# EasyEDA Pro project 眼球小板_立创文件.epro, schematic Schematic1

## Sheets
1 Power: Assembly Variant: Basic; Board Name: Board1; Create Date: 2026-07-28; Page Name: P1; Project Name: AI小板; Schematic Name: Schematic1; Update Date: 2026-07-28; Company: 嘉立创EDA; Page Size: A4; Version: V1.0
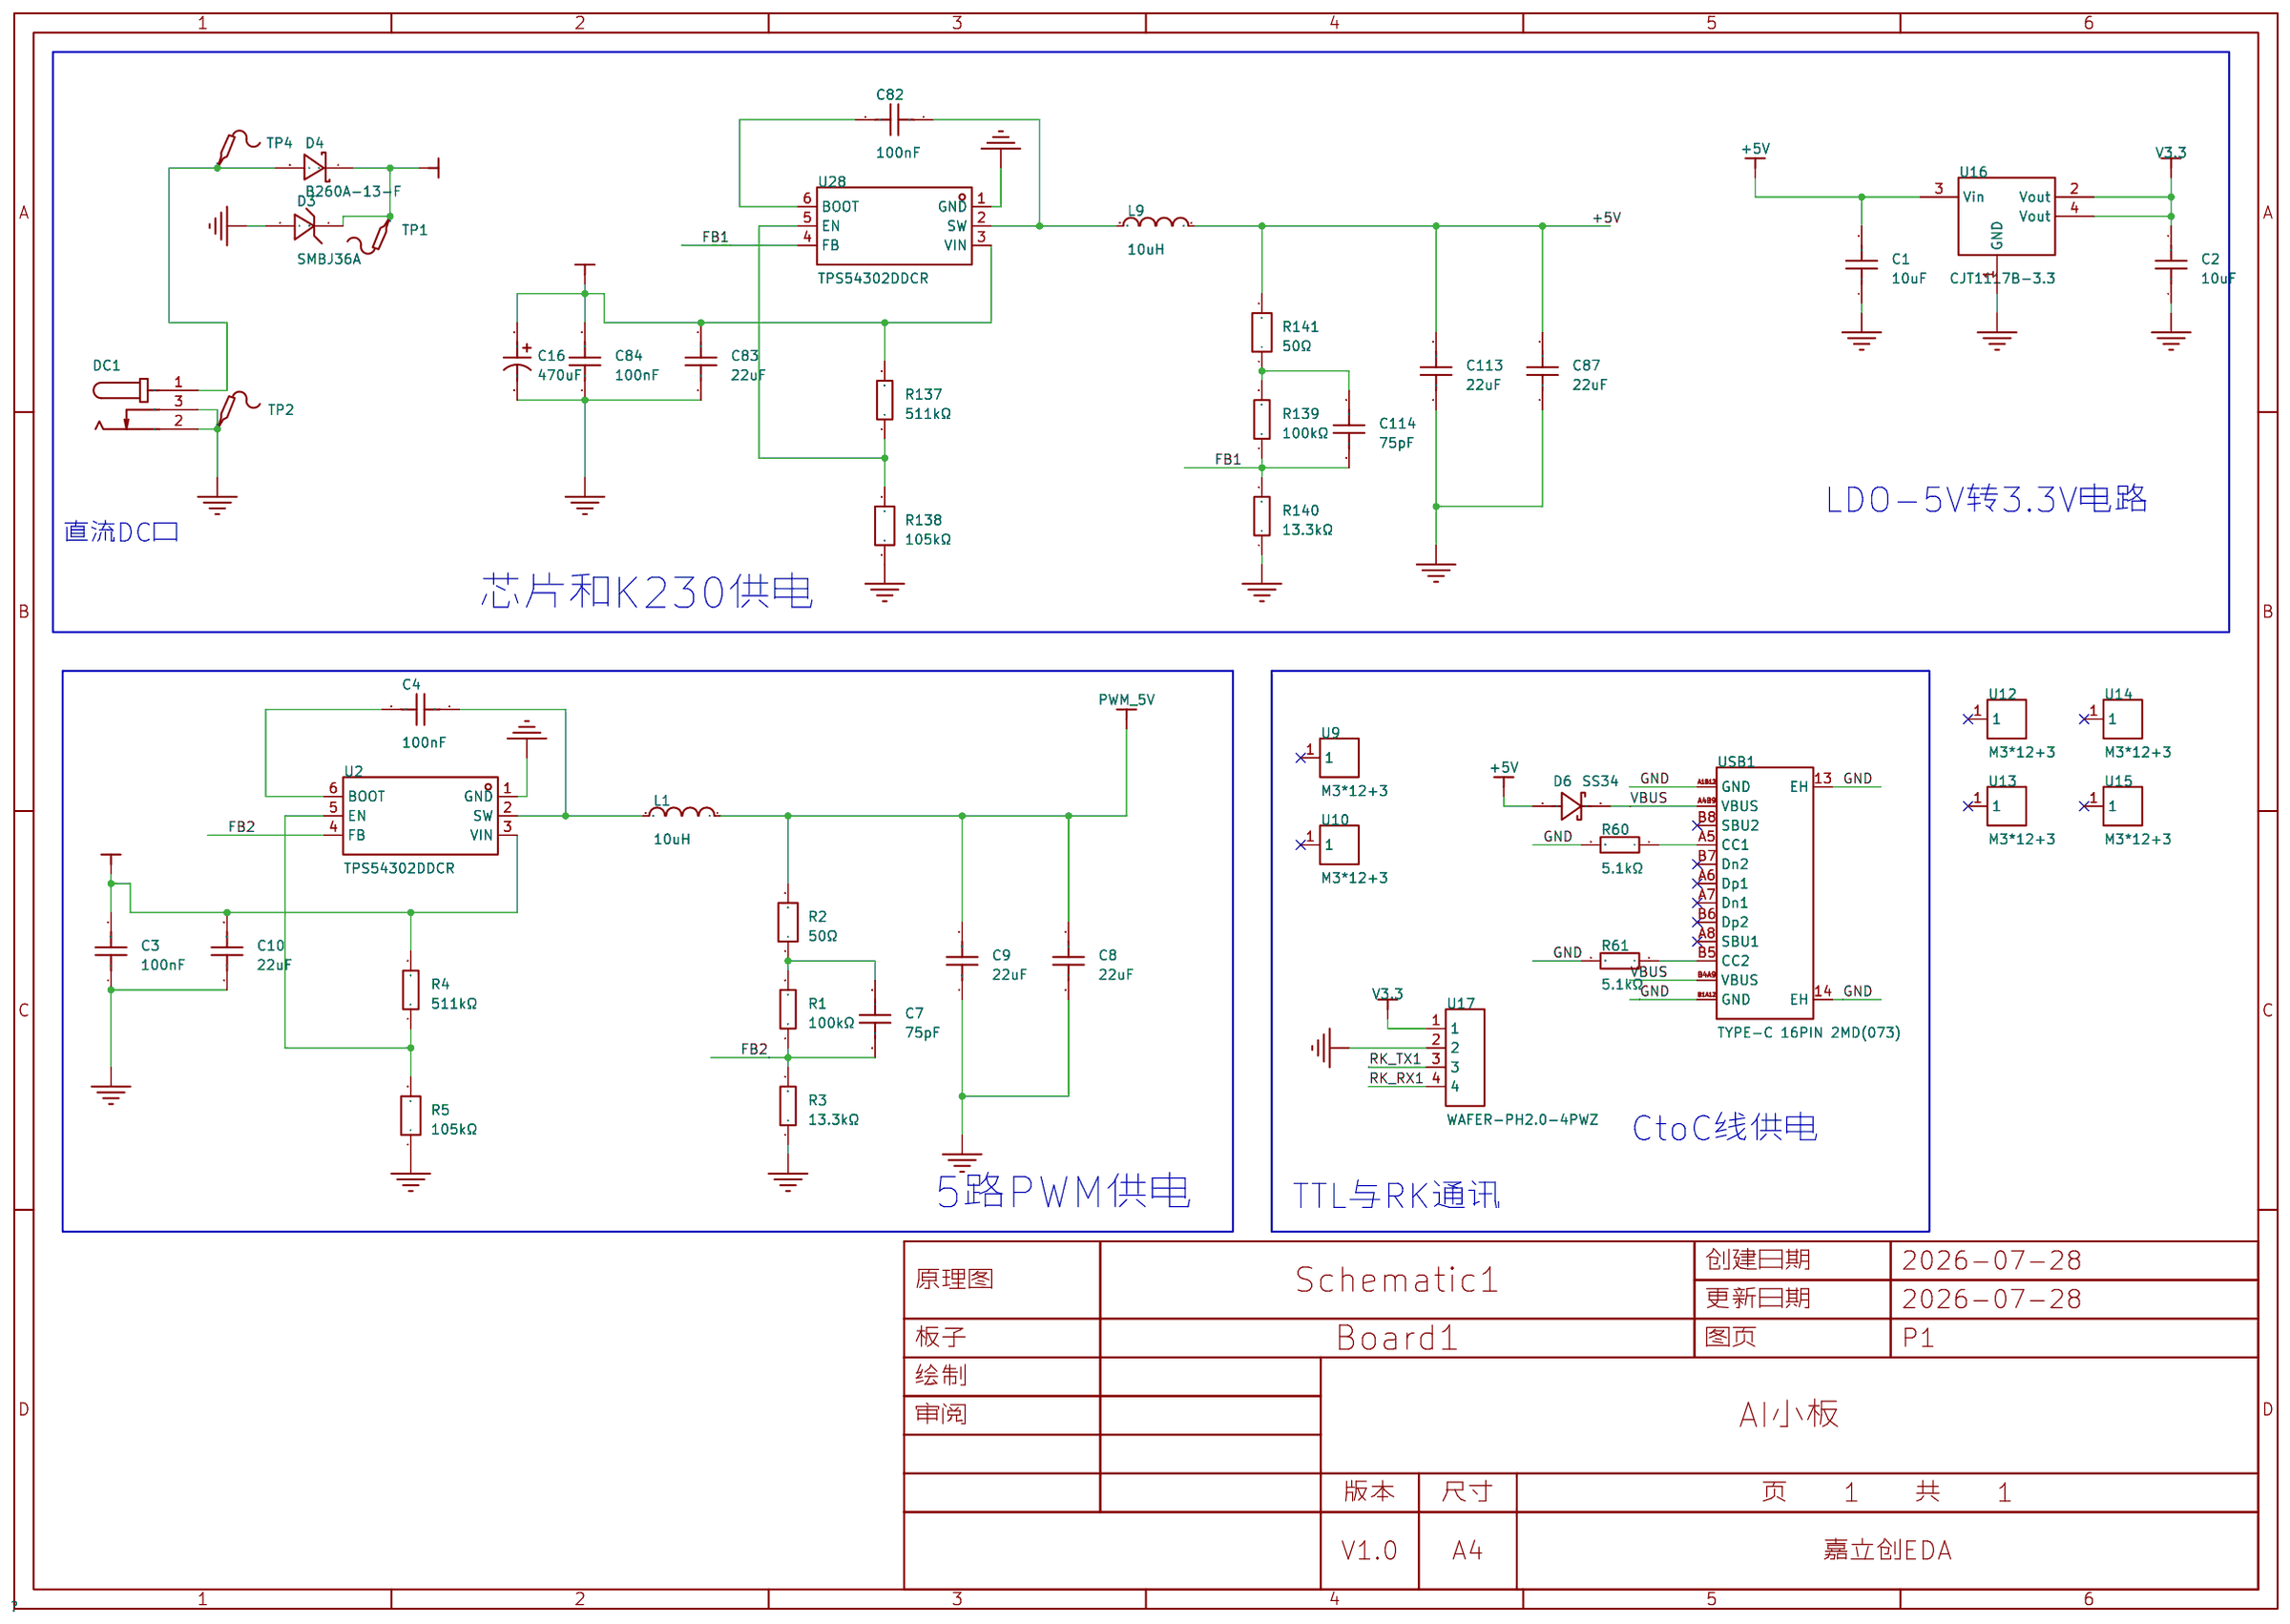
[diagram p0: Power]
2 five_PWM: Create Date: 2026-07-16; Update Date: 2026-07-16
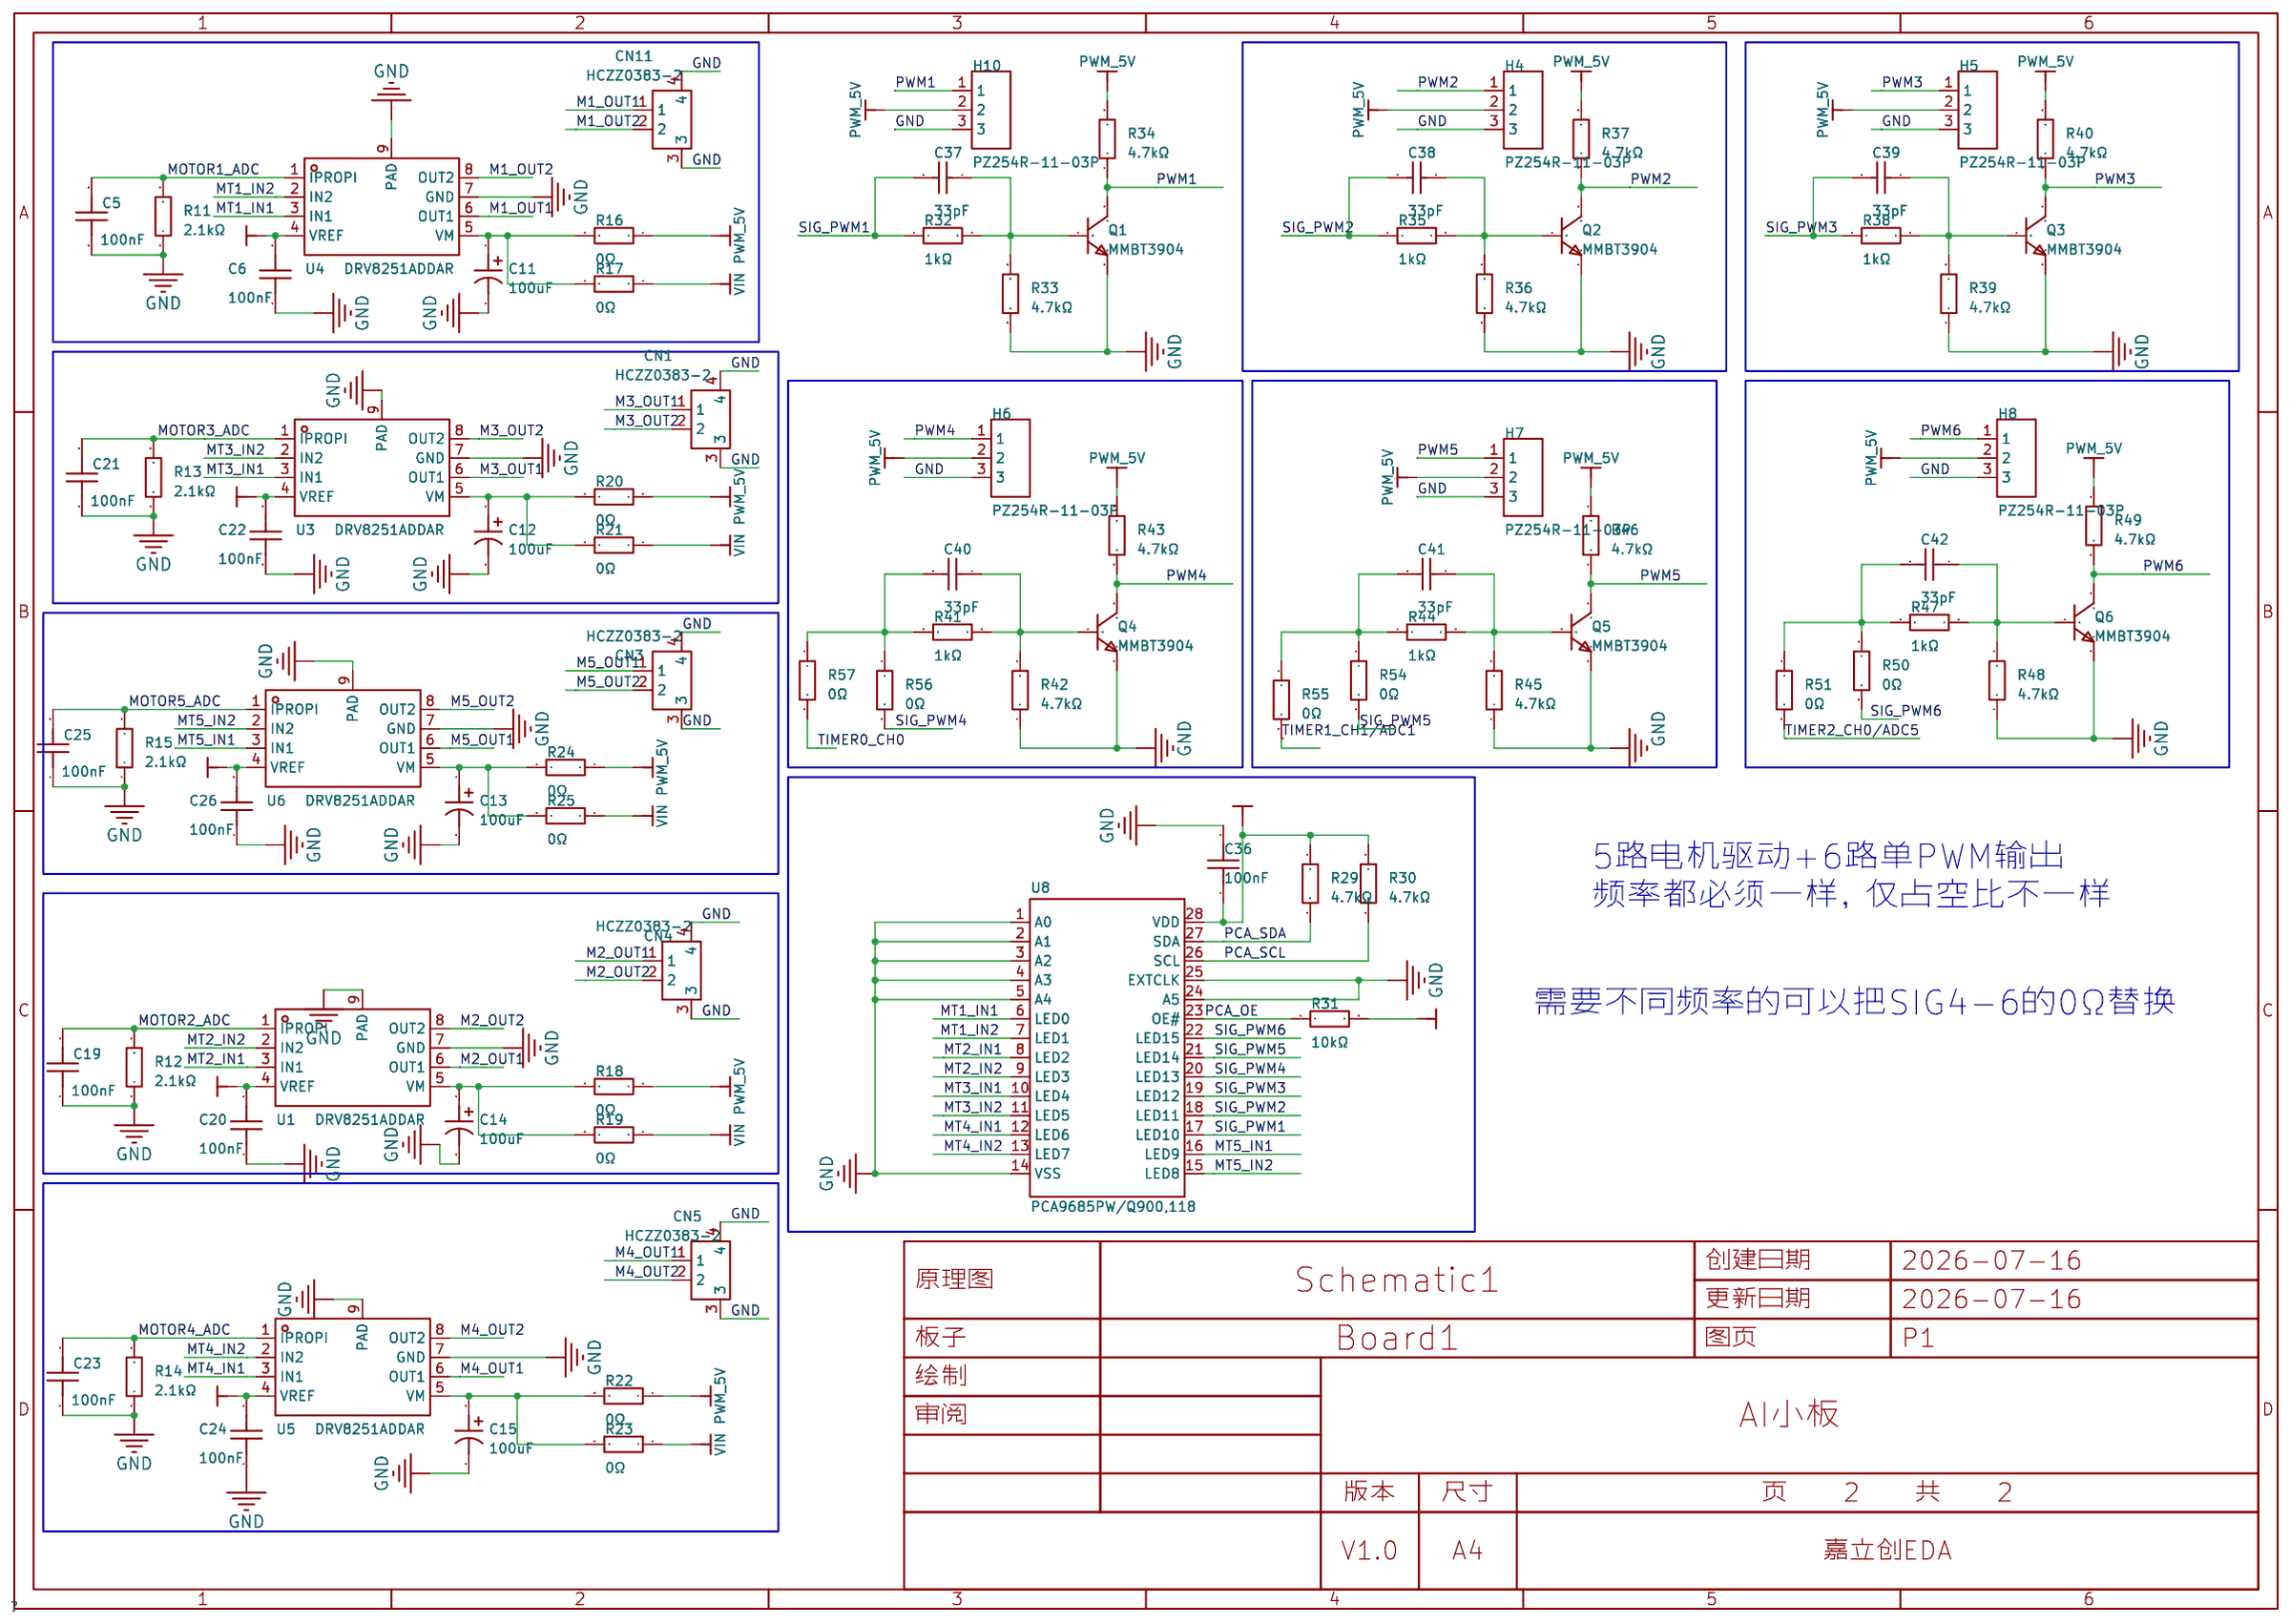
[diagram p1: five_PWM]
3 MCU: Page Name: P2
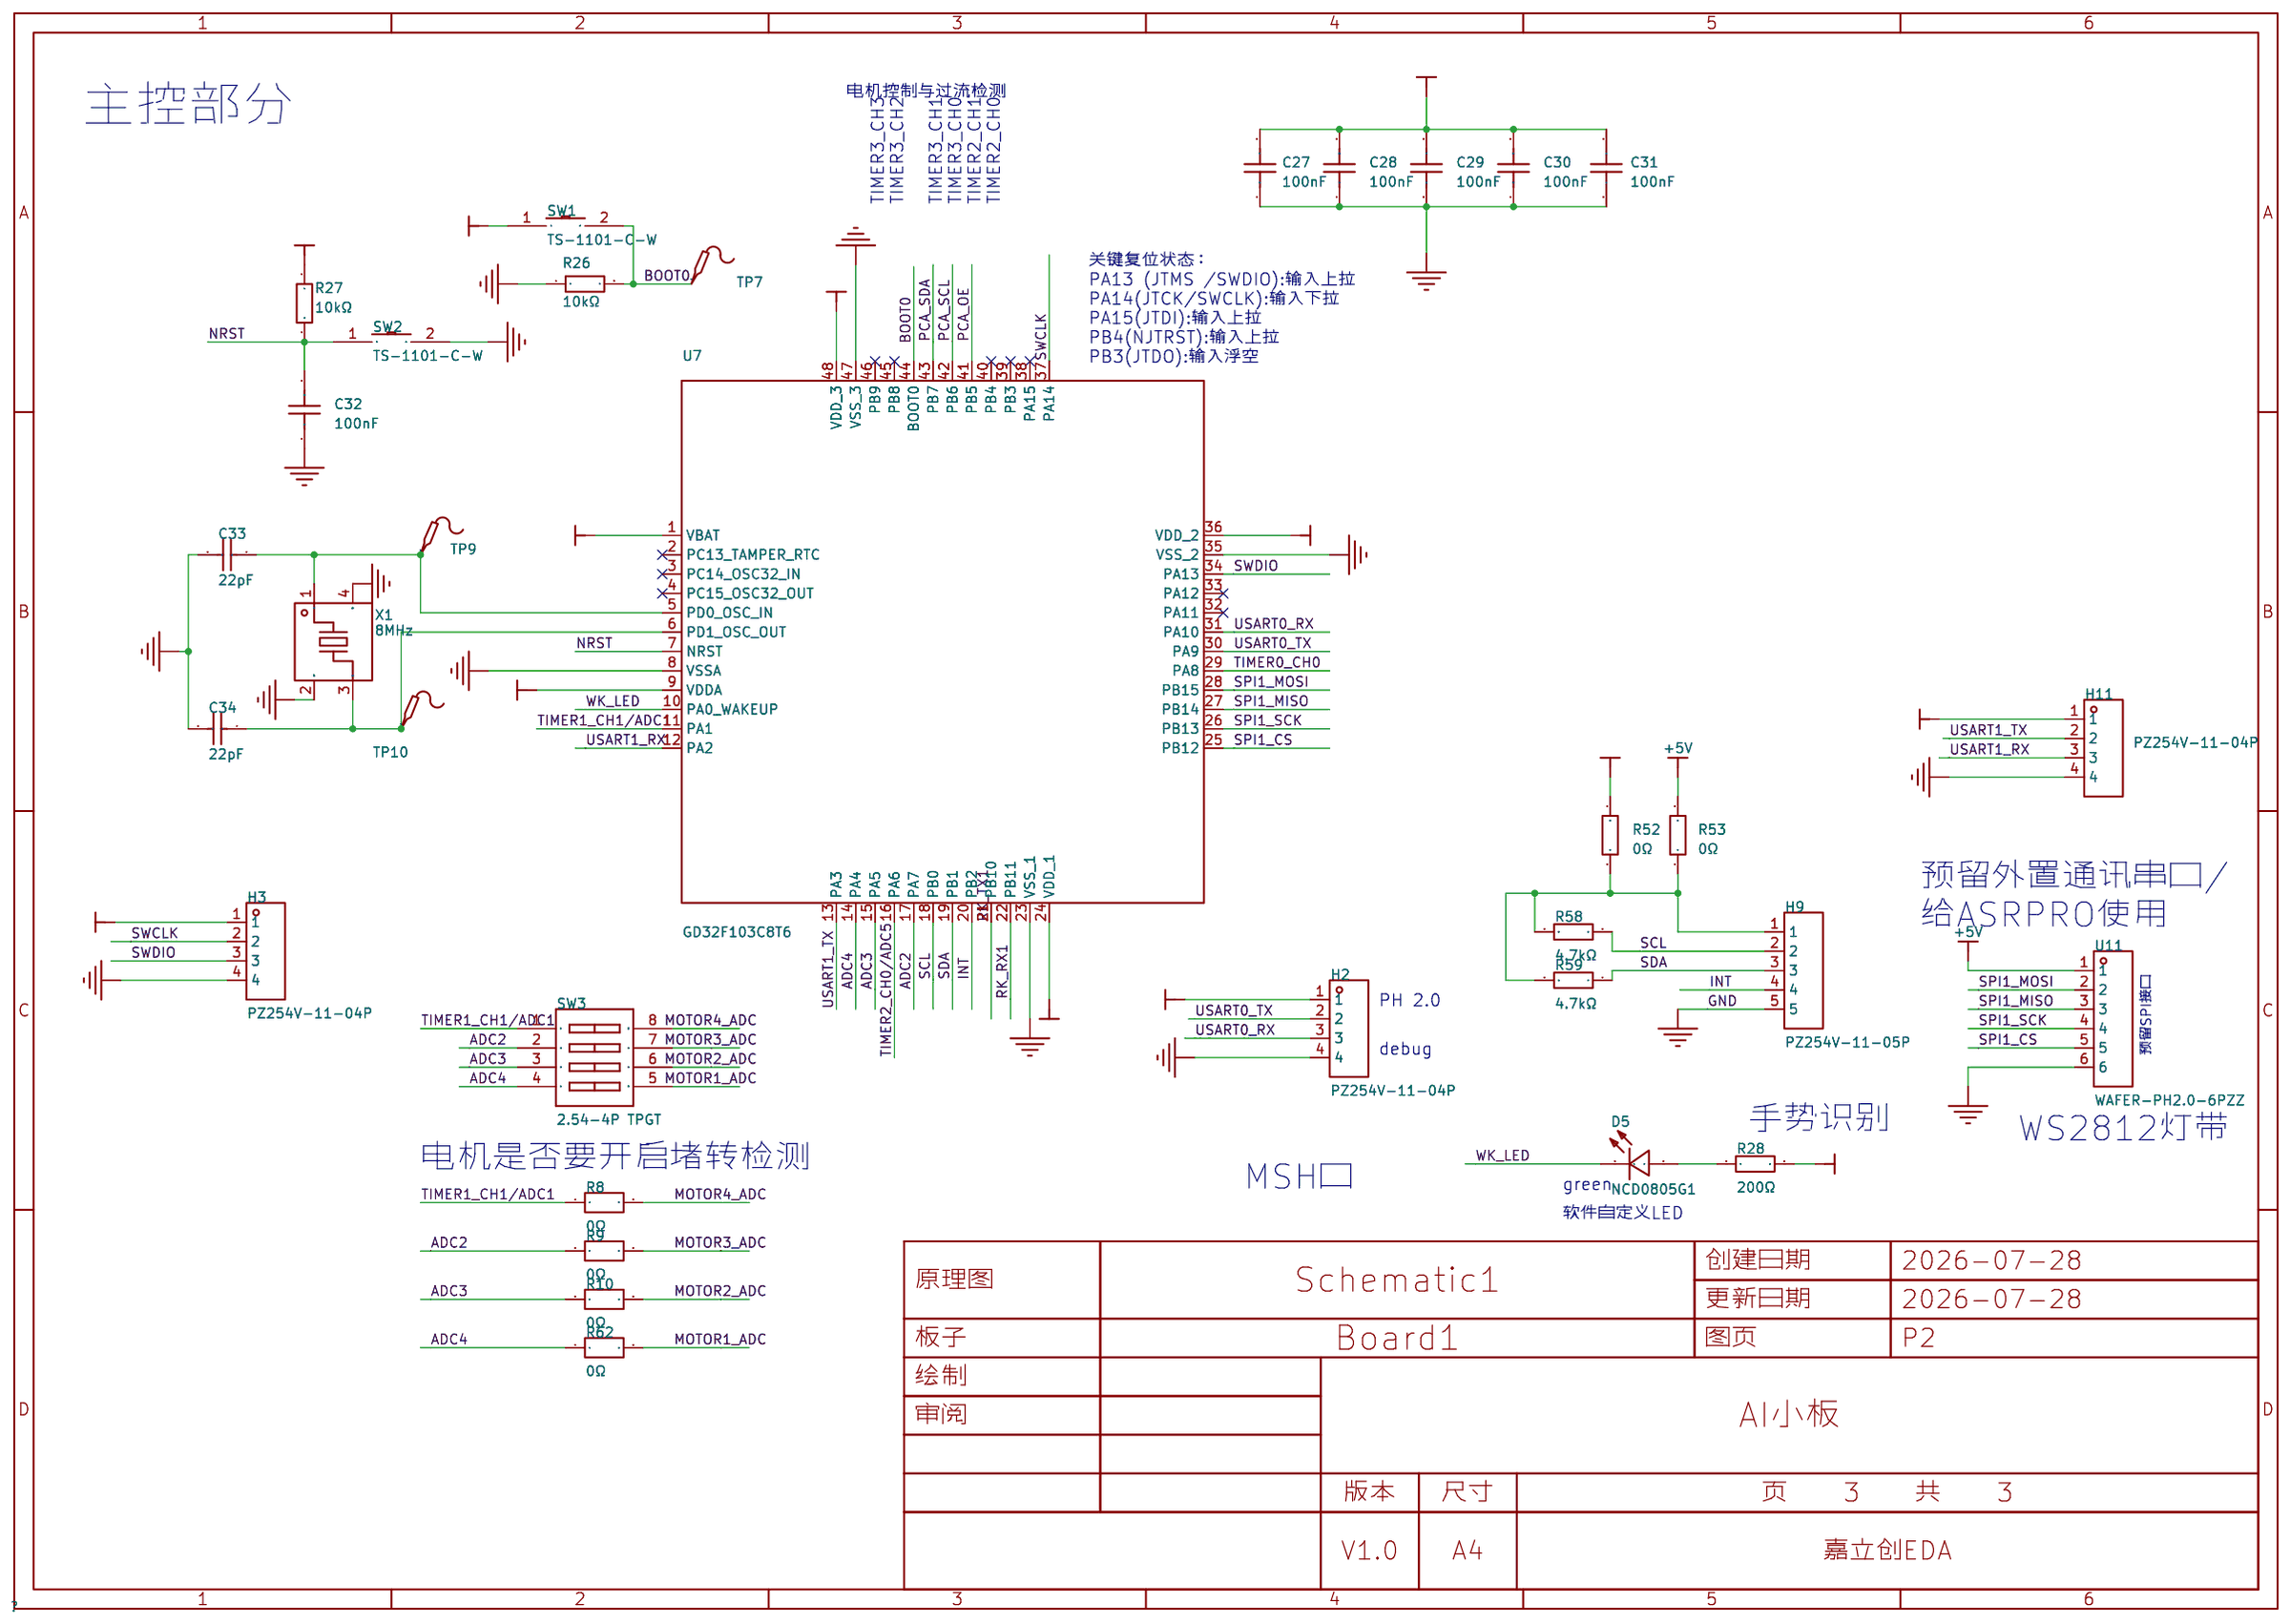
[diagram p2: MCU]
4 ASRPRO: Create Date: 2026-07-18; Update Date: 2026-07-18
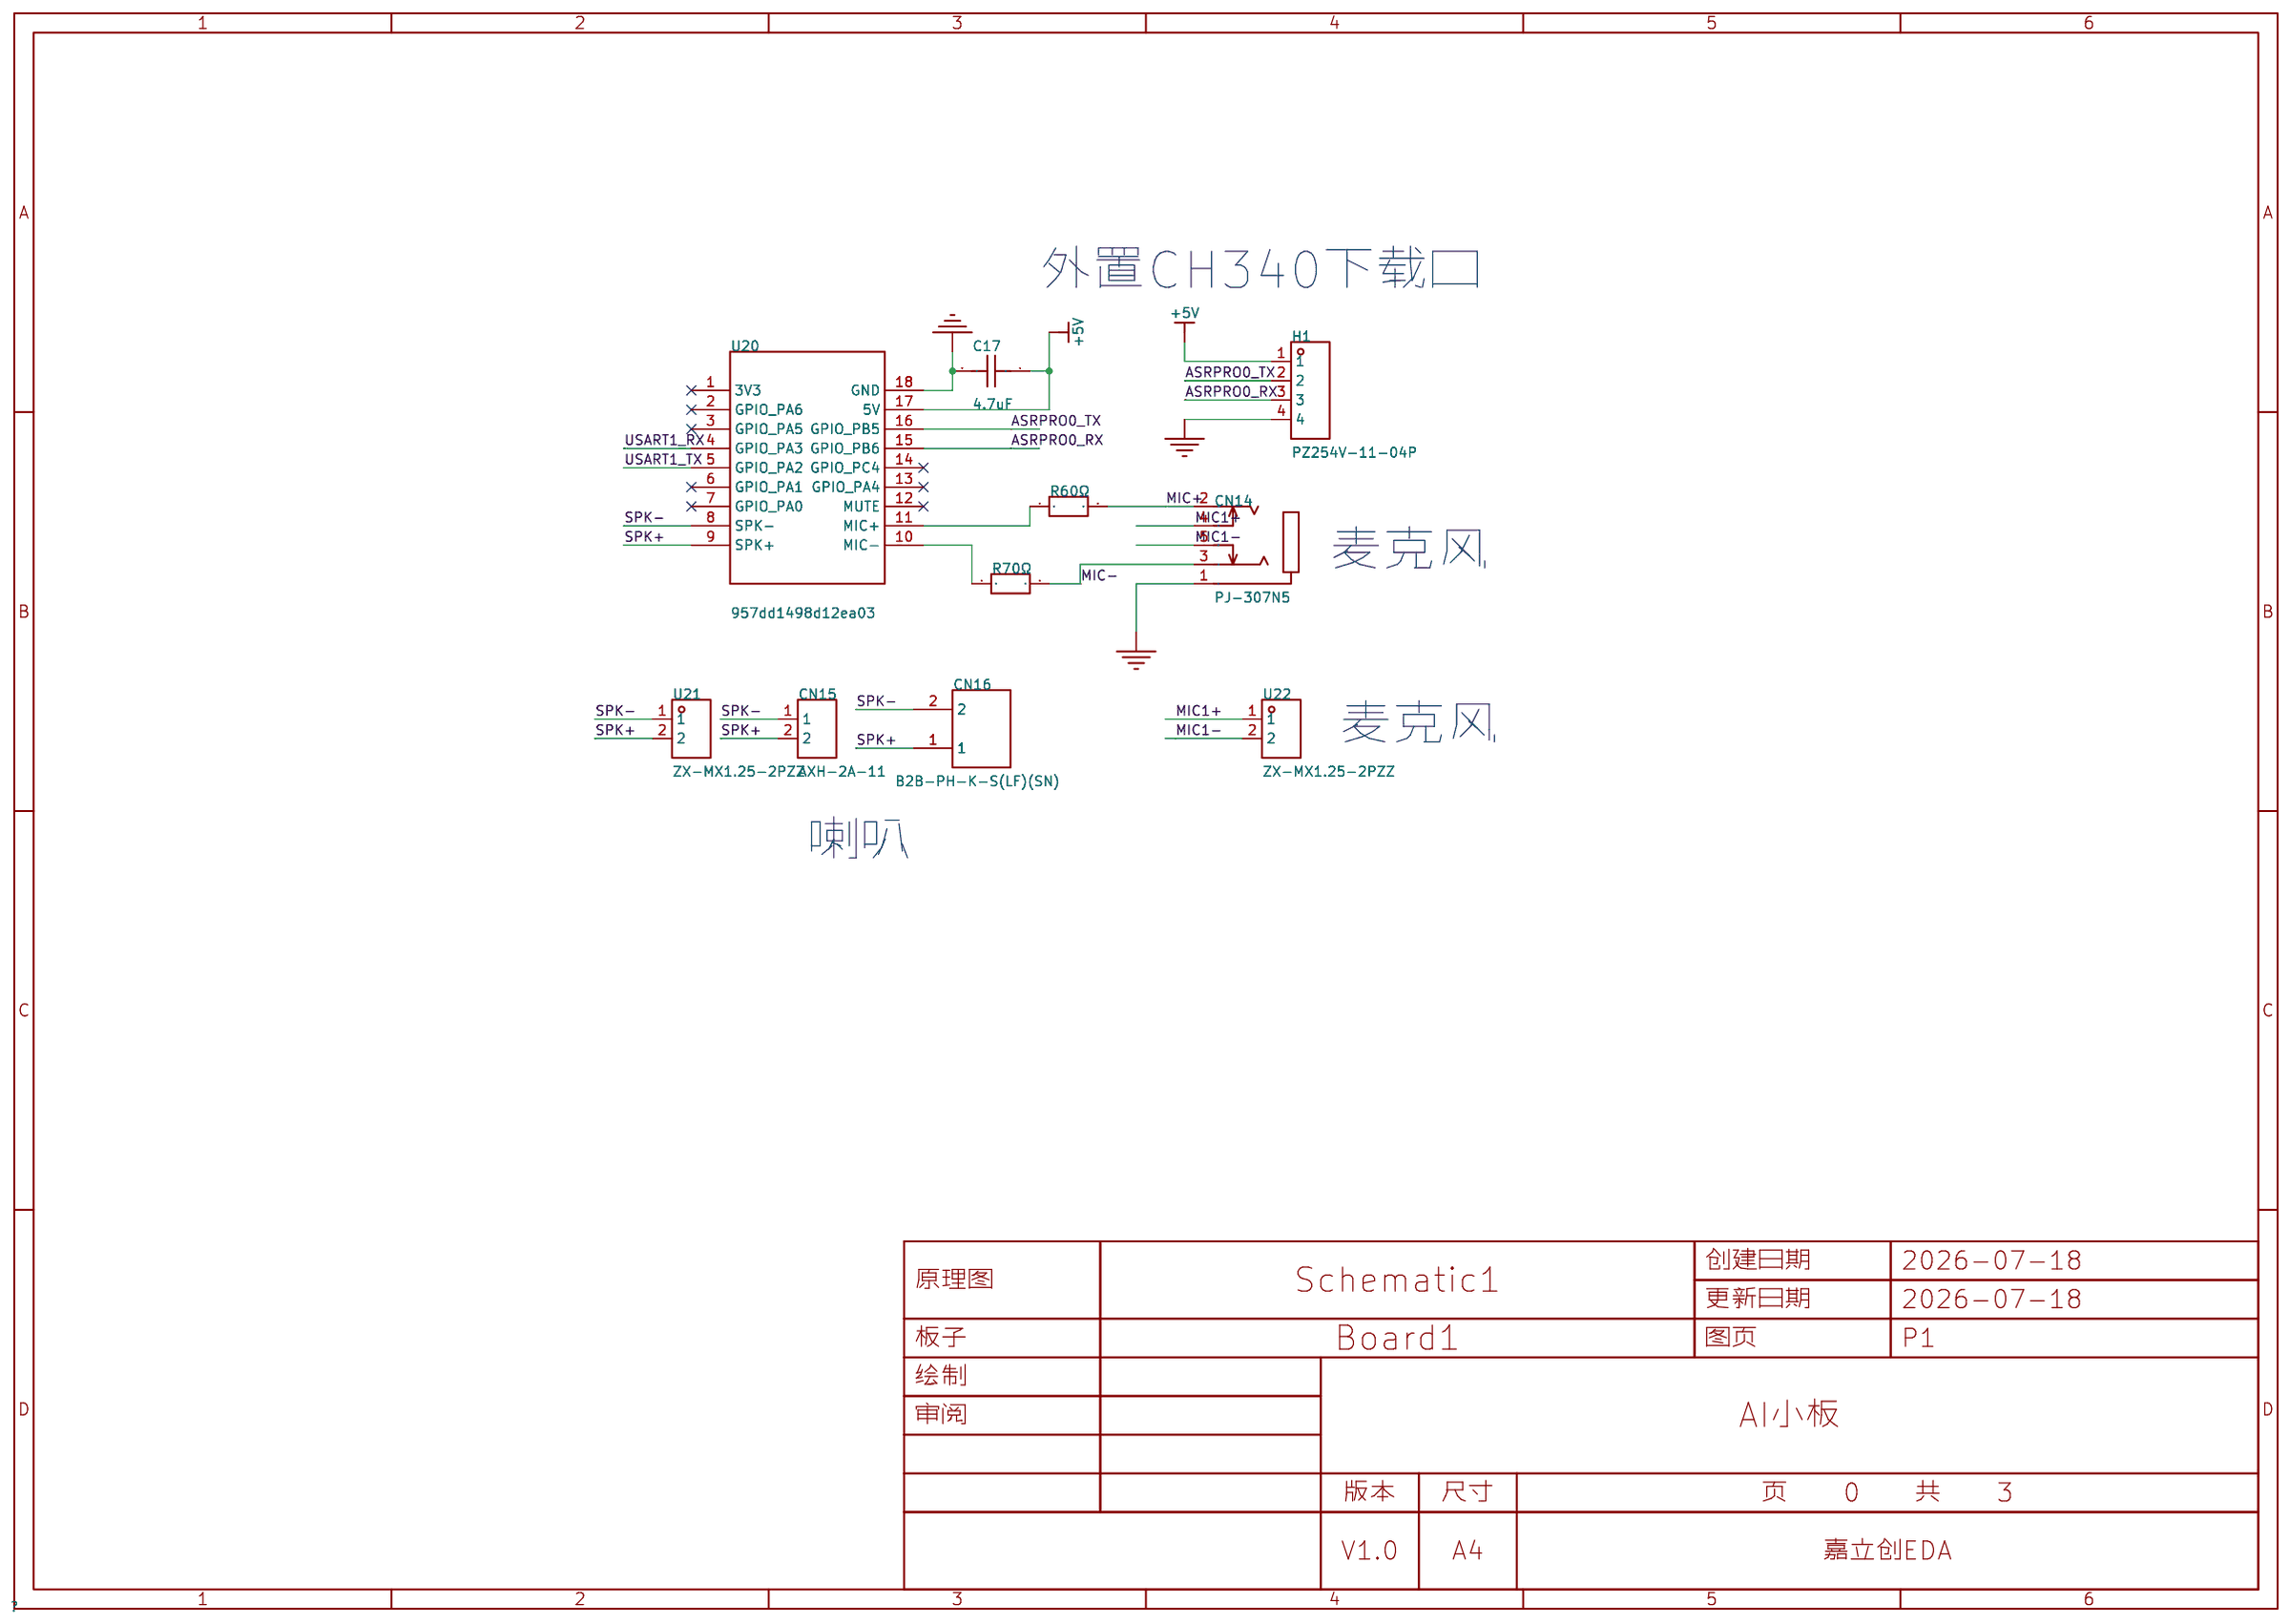
[diagram p3: ASRPRO]
5 日志
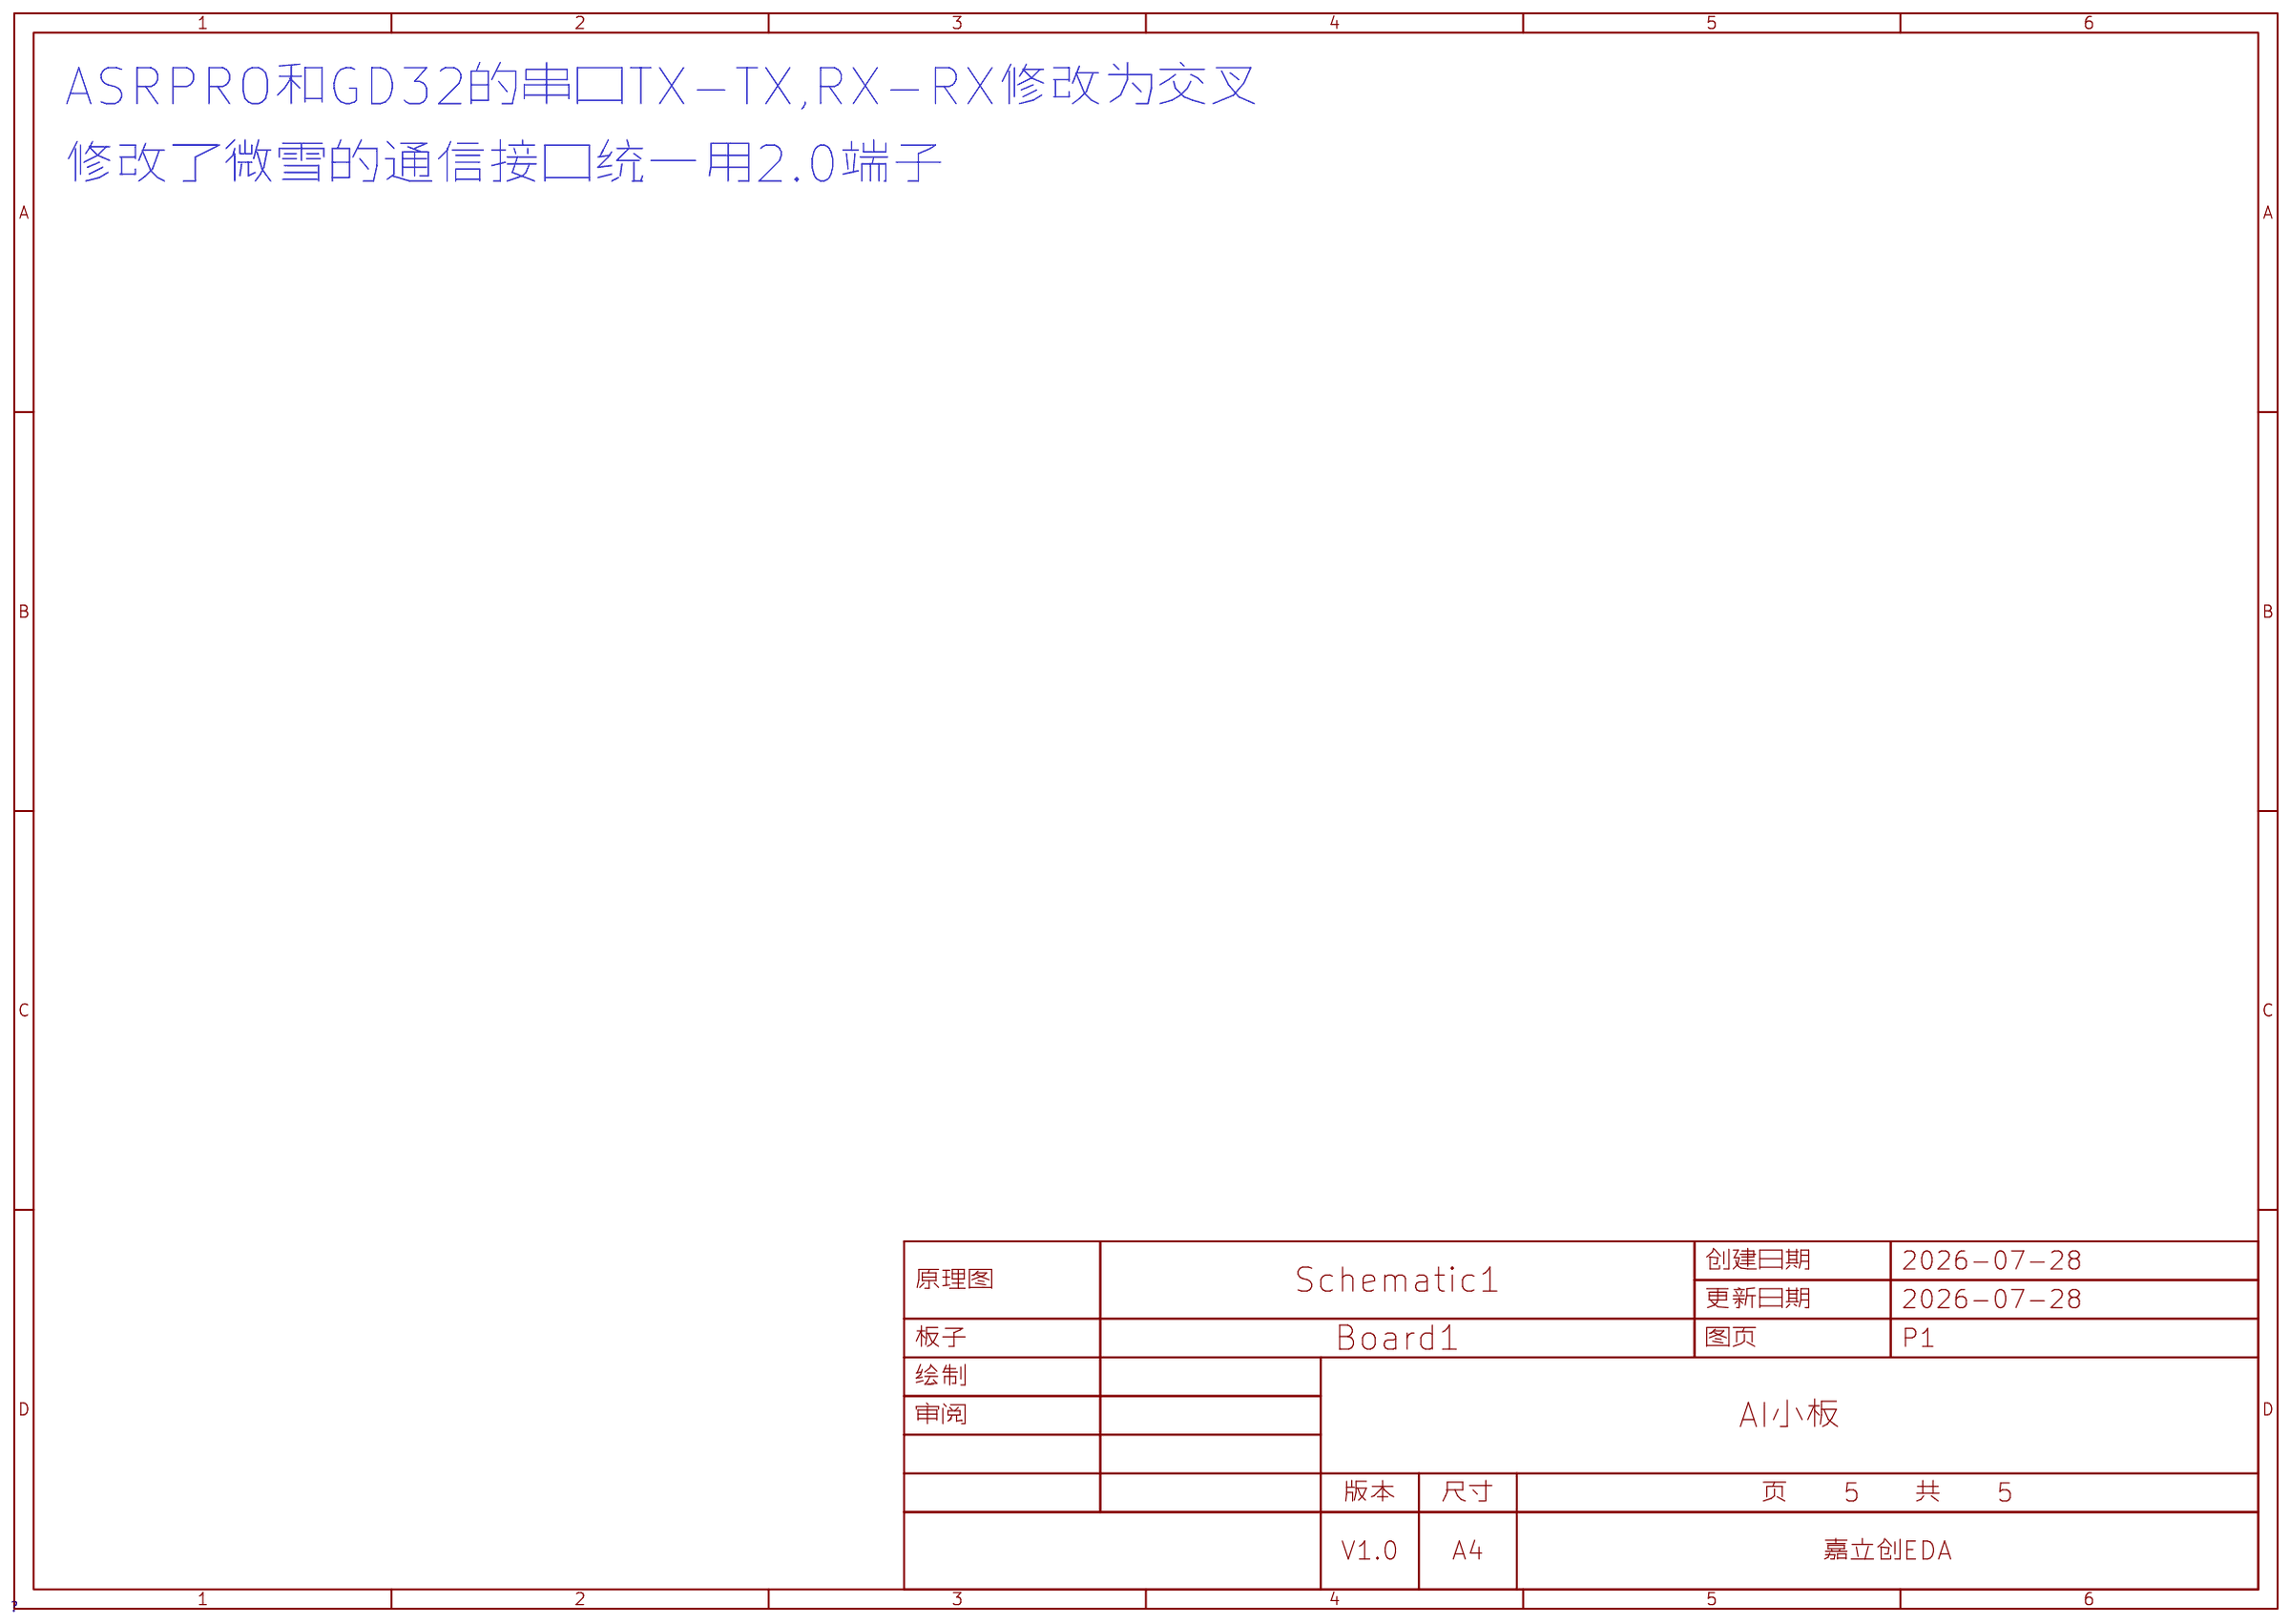
[diagram p4: 日志]

## Parts
sheet ASRPRO
C17  4.7uF  [C0603_1]
CN14  PJ-307N5  [AUDIO-TH_PJ-307N5]
CN15  AXH-2A-11  [CONN-TH_KH-XH-2A-Z]
CN16  B2B-PH-K-S(LF)(SN)  [CONN-TH_B2B-PH-K-S]
H1  PZ254V-11-04P  [HDR-TH_4P-P2.54-V-M]
R6  0Ω  [R0603_1]
R7  0Ω  [R0603_1]
U20  957dd1498d12ea03  [ASRPRO邮票孔]
U21  ZX-MX1.25-2PZZ  [CONN-TH_2P-P1.25_MEGASTAR_ZX-MX1.25-2PZZ]
U22  ZX-MX1.25-2PZZ  [CONN-TH_2P-P1.25_MEGASTAR_ZX-MX1.25-2PZZ]
sheet five_PWM
C5  100nF  [C0603]
C6  100nF  [C0603]
C11  100uF  [CAP-SMD_BD6.3-L6.6-W6.6-RD]
C12  100uF  [CAP-SMD_BD6.3-L6.6-W6.6-RD]
C13  100uF  [CAP-SMD_BD6.3-L6.6-W6.6-RD]
C14  100uF  [CAP-SMD_BD6.3-L6.6-W6.6-RD]
C15  100uF  [CAP-SMD_BD6.3-L6.6-W6.6-RD]
C19  100nF  [C0603]
C20  100nF  [C0603]
C21  100nF  [C0603]
C22  100nF  [C0603]
C23  100nF  [C0603]
C24  100nF  [C0603]
C25  100nF  [C0603]
C26  100nF  [C0603]
C36  100nF  [C0603]
C37  33pF  [C0603_1]
C38  33pF  [C0603_1]
C39  33pF  [C0603_1]
C40  33pF  [C0603_1]
C41  33pF  [C0603_1]
C42  33pF  [C0603_1]
CN1  HCZZ0383-2  [CONN-SMD_2P-P2.00_HCZZ0383-2]
CN3  HCZZ0383-2  [CONN-SMD_2P-P2.00_HCZZ0383-2]
CN4  HCZZ0383-2  [CONN-SMD_2P-P2.00_HCZZ0383-2]
CN5  HCZZ0383-2  [CONN-SMD_2P-P2.00_HCZZ0383-2]
CN11  HCZZ0383-2  [CONN-SMD_2P-P2.00_HCZZ0383-2]
H4  PZ254R-11-03P  [HDR-TH_3P-P2.54-H-M-W10.4]
H5  PZ254R-11-03P  [HDR-TH_3P-P2.54-H-M-W10.4]
H6  PZ254R-11-03P  [HDR-TH_3P-P2.54-H-M-W10.4]
H7  PZ254R-11-03P  [HDR-TH_3P-P2.54-H-M-W10.4]
H8  PZ254R-11-03P  [HDR-TH_3P-P2.54-H-M-W10.4]
H10  PZ254R-11-03P  [HDR-TH_3P-P2.54-H-M-W10.4]
Q1  MMBT3904  [SOT-23-3_L2.9-W1.3-P1.90-LS2.4-BR]
Q2  MMBT3904  [SOT-23-3_L2.9-W1.3-P1.90-LS2.4-BR]
Q3  MMBT3904  [SOT-23-3_L2.9-W1.3-P1.90-LS2.4-BR]
Q4  MMBT3904  [SOT-23-3_L2.9-W1.3-P1.90-LS2.4-BR]
Q5  MMBT3904  [SOT-23-3_L2.9-W1.3-P1.90-LS2.4-BR]
Q6  MMBT3904  [SOT-23-3_L2.9-W1.3-P1.90-LS2.4-BR]
R11  2.1kΩ  [R0603_1]
R12  2.1kΩ  [R0603_1]
R13  2.1kΩ  [R0603_1]
R14  2.1kΩ  [R0603_1]
R15  2.1kΩ  [R0603_1]
R16  0Ω  [R0603_1]
R17  0Ω  [R0603_1]  (no BOM)
R18  0Ω  [R0603_1]
R19  0Ω  [R0603_1]  (no BOM)
R20  0Ω  [R0603_1]
R21  0Ω  [R0603_1]  (no BOM)
R22  0Ω  [R0603_1]
R23  0Ω  [R0603_1]  (no BOM)
R24  0Ω  [R0603_1]
R25  0Ω  [R0603_1]  (no BOM)
R29  4.7kΩ  [R0603_1]
R30  4.7kΩ  [R0603_1]
R31  10kΩ  [R0603_1]
R32  1kΩ  [R0603_1]
R33  4.7kΩ  [R0603_1]
R34  4.7kΩ  [R0603_1]
R35  1kΩ  [R0603_1]
R36  4.7kΩ  [R0603_1]
R37  4.7kΩ  [R0603_1]
R38  1kΩ  [R0603_1]
R39  4.7kΩ  [R0603_1]
R40  4.7kΩ  [R0603_1]
R41  1kΩ  [R0603_1]
R42  4.7kΩ  [R0603_1]
R43  4.7kΩ  [R0603_1]
R44  1kΩ  [R0603_1]
R45  4.7kΩ  [R0603_1]
R46  4.7kΩ  [R0603_1]
R47  1kΩ  [R0603_1]
R48  4.7kΩ  [R0603_1]
R49  4.7kΩ  [R0603_1]
R50  0Ω  [R0603_1]
R51  0Ω  [R0603]  (no BOM)
R54  0Ω  [R0603_1]
R55  0Ω  [R0603]  (no BOM)
R56  0Ω  [R0603_1]
R57  0Ω  [R0603]  (no BOM)
U1  DRV8251ADDAR  [SOPOWERPAD-8_L4.9-W3.9-P1.27-LS6.0-TL-EP]
U3  DRV8251ADDAR  [SOPOWERPAD-8_L4.9-W3.9-P1.27-LS6.0-TL-EP]
U4  DRV8251ADDAR  [SOPOWERPAD-8_L4.9-W3.9-P1.27-LS6.0-TL-EP]
U5  DRV8251ADDAR  [SOPOWERPAD-8_L4.9-W3.9-P1.27-LS6.0-TL-EP]
U6  DRV8251ADDAR  [SOPOWERPAD-8_L4.9-W3.9-P1.27-LS6.0-TL-EP]
U8  PCA9685PW/Q900,118  [TSSOP-28_L9.7-W4.4-P0.65-LS6.4-BL]
sheet MCU
C27  100nF  [C0603_1]
C28  100nF  [C0603_1]
C29  100nF  [C0603_1]
C30  100nF  [C0603_1]
C31  100nF  [C0603_1]
C32  100nF  [C0603]
C33  22pF  [C0603_1]
C34  22pF  [C0603_1]
D5  NCD0805G1  [LED0805-R-RD]
H2  PZ254V-11-04P  [HDR-TH_4P-P2.54-V-M]
H3  PZ254V-11-04P  [HDR-TH_4P-P2.54-V-M]
H9  PZ254V-11-05P  [HDR-TH_5P-P2.54-V-M]
H11  PZ254V-11-04P  [HDR-TH_4P-P2.54-V-M]
R8  0Ω  [R0603_1]
R9  0Ω  [R0603_1]
R10  0Ω  [R0603_1]
R26  10kΩ  [R0603]
R27  10kΩ  [R0603]
R28  200Ω  [R0603_1]
R52  0Ω  [R0603_1]
R53  0Ω  [R0603_1]  (no BOM)
R58  4.7kΩ  [R0603_1]
R59  4.7kΩ  [R0603_1]
R62  0Ω  [R0603_1]
SW1  TS-1101-C-W  [SW-SMD_L6.0-W3.3-LS8.0]
SW2  TS-1101-C-W  [SW-SMD_L6.0-W3.3-LS8.0]
SW3  2.54-4P TPGT  [SW-SMD_8P-L10.2-W6.2-P2.54-LS9.4]
TP7  -  [Test-Point-1.5mm]
TP9  -  [Test-Point-1.5mm]
TP10  -  [Test-Point-1.5mm]
U7  GD32F103C8T6  [TQFP-48_L7.0-W7.0-P0.50-LS9.0-BL]
U11  WAFER-PH2.0-6PZZ  [CONN-TH_6P-P2.00_PH2.0-6P]
X1  8MHz  [CRYSTAL-SMD_4P-L3.2-W2.5-BL]
sheet Power
C1  10uF  [C0603_1]
C2  10uF  [C0603_1]
C3  100nF  [C0603_1]
C4  100nF  [C0603_1]
C7  75pF  [C0603_1]
C8  22uF  [C0805]
C9  22uF  [C0805]
C10  22uF  [C0805]
C16  470uF  [CAP-SMD_BD10.0-L10.3-W10.3-LS11.0]
C82  100nF  [C0603_1]
C83  22uF  [C0805]
C84  100nF  [C0603_1]
C87  22uF  [C0805]
C113  22uF  [C0805]
C114  75pF  [C0603_1]
D3  SMBJ36A  [SMB_L4.4-W3.6-LS5.3-RD]
D4  B260A-13-F  [SMA_L4.4-W2.8-LS5.4-RD]
D6  SS34  [SMA_L4.3-W2.6-LS5.0-FD]
DC1  DC-005-A200  [DC-IN-TH_DC-005-A200]
L1  10uH  [IND-SMD_L5.4-W5.2_FXL0530]
L9  10uH  [IND-SMD_L5.4-W5.2_FXL0530]
R1  100kΩ  [R0603_1]
R2  50Ω  [R0603_1]
R3  13.3kΩ  [R0603_1]
R4  511kΩ  [R0603_1]
R5  105kΩ  [R0603_1]
R60  5.1kΩ  [R0603_1]
R61  5.1kΩ  [R0603_1]
R137  511kΩ  [R0603_1]
R138  105kΩ  [R0603_1]
R139  100kΩ  [R0603_1]
R140  13.3kΩ  [R0603_1]
R141  50Ω  [R0603_1]
TP1  -  [Test-Point-1.5mm]
TP2  -  [Test-Point-1.5mm]
TP4  -  [Test-Point-1.5mm]
U2  TPS54302DDCR  [SOT-23-6_L2.9-W1.6-P0.95-LS2.8-BL]
U9  M3*12+3  [TH_BD4.7-D3.0]
U10  M3*12+3  [TH_BD4.7-D3.0]
U12  M3*12+3  [TH_BD4.7-D3.0]
U13  M3*12+3  [TH_BD4.7-D3.0]
U14  M3*12+3  [TH_BD4.7-D3.0]
U15  M3*12+3  [TH_BD4.7-D3.0]
U16  CJT1117B-3.3  [SOT-223-4_L6.5-W3.5-P2.30-LS7.0-BR]
U17  WAFER-PH2.0-4PWZ  [CONN-TH_4P-P2.00_BX-PH2.0-4PWZ]
U28  TPS54302DDCR  [SOT-23-6_L2.9-W1.6-P0.95-LS2.8-BL]
USB1  TYPE-C 16PIN 2MD(073)  [USB-C-SMD_TYPE-C-16PIN-2MD-073]

## Library data of the parts
C17 = CGA0603X5R475K160JT: 容值:4.7uF;精度:±10%;额定电压:16V;温度系数:X5R;; LCSC Part Name: 4.7uF ±10% 16V; Supplier Part: C6119855; Manufacturer: HRE(芯声); Supplier Footprint: 0603; JLCPCB Part Class: Extended Part; Datasheet: https://item.szlcsc.com/datasheet/CGA0603X5R475K160JT/7062561.html; Supplier: LCSC; Tolerance: ±10%; Voltage Rating: 16V; Temperature Coefficient: X5R
CN14 = PJ-307N5: 连接器类型:3.5mm耳机座;额定电流:500mA;额定电压:30V;工作温度:-20℃~+70℃;; LCSC Part Name: 3.5mm耳机座; Supplier Part: C692542; Manufacturer: XKB Connection(中国星坤); Supplier Footprint: 插件; JLCPCB Part Class: Extended Part; Datasheet: https://item.szlcsc.com/datasheet/PJ-307N5/724425.html; Supplier: LCSC; Connector Type: 3.5mm耳机座; Current Rating: 500mA; Voltage Rating (Max): 30V; Operating Temperature: -20℃~+70℃
CN15 = AXH-2A-11: 插针结构:1x2P;间距:2.5mm;安装方式:直插;参考系列:XH;总PIN数:2P;排数:1;每排PIN数:2;行距:2.5mm;额定电流:2A;触头材质:黄铜;触头镀层:锡;工作温度:-25℃~+85℃;; LCSC Part Name: 1x2P 间距:2.5mm 直插 系列:XH; Supplier Part: C42422438; Manufacturer: JXTCONN(聚兴泰); Supplier Footprint: 插件,P=2.54mm; JLCPCB Part Class: Extended Part; Datasheet: https://item.szlcsc.com/datasheet/AXH-2A-11/44442049.html; Supplier: LCSC; Pins Structure: 1x2P; Pitch: 2.5mm; Mounting Type: 直插; Reference Series: XH; Number of Pins: 2P; Number of Rows: 1; Number of PINs Per Row: 2; Row Spacing: 2.5mm; Current Rating: 2A; Contact Material: 黄铜; Contact Plating: 锡; Operating Temperature: -25℃~+85℃; Voltage Rating: 250V; Plastic Material: PA66; Flame Retardant Rating: UL94V-0; Color: 白色; Z-Height of the Board: 7mm; X-Length of Bottom Edge on Board (Spacing Line): 7.5mm; Y-Width of Bottom Edge on Board: 5.9mm
CN16 = B2B-PH-K-S(LF)(SN): 插针结构:1x2P;间距:2mm;安装方式:直插;参考系列:PH;总PIN数:2P;排数:1;每排PIN数:2;行距:-;额定电流:2A;触头材质:黄铜;触头镀层:锡;工作温度:-25℃~+85℃;; LCSC Part Name: 1x2P 间距:2mm 直插 系列:PH; Supplier Part: C131337; Manufacturer: JST; Supplier Footprint: 插件,P=2mm; JLCPCB Part Class: Extended Part; Datasheet: https://item.szlcsc.com/datasheet/B2B-PH-K-S(LF)(SN)/142630.html; Supplier: LCSC; Pins Structure: 1x2P; Pitch: 2mm; Mounting Type: 直插; Reference Series: PH; Number of Pins: 2P; Number of Rows: 1; Number of PINs Per Row: 2; Current Rating: 2A; Contact Material: 黄铜; Contact Plating: 锡; Operating Temperature: -25℃~+85℃; Voltage Rating: 100V; Plastic Material: PA66; Flame Retardant Rating: UL94V-0; Supplementary Features: 打K脚; Color: 白色; Z-Height of the Board: 6mm; X-Length of Bottom Edge on Board (Spacing Line): 5.9mm; Y-Width of Bottom Edge on Board: 4.5mm
H1-H3 H11 = PZ254V-11-04P: 插针结构:1x4P;间距:2.54mm;行距:-;圆针/方针:方针;安装方式:直插;排数:单排;总PIN位数:4P;额定电流:3A;额定电压:250V;配合针长度:6mm;塑高:2.5mm;端接针长度:3mm;触头材质:-;工作温度:-40℃~+105℃;颜色:黑色;; LCSC Part Name: 1x4P 间距:2.54mm 方针 直插; Supplier Part: C2691448; Manufacturer: XFCN(兴飞); Supplier Footprint: 插件,P=2.54mm; JLCPCB Part Class: Extended Part; Datasheet: https://item.szlcsc.com/datasheet/PZ254V-11-04P/2801085.html; Supplier: LCSC; Pin Structure: 1x4P; Pitch: 2.54mm; Circluar Pins/Square Pins: 方针; Mounting Type: 直插; Number of Rows: 单排; Number of Pins: 4P; Current Rating: 3A; Voltage Rating (Max): 250V; Length of Mating Pin: 6mm; Insulation Height: 2.5mm; Length of End Connection Pin: 3mm; Operating Temperature: -40℃~+105℃; Color: 黑色
R6-R10 R62 = FRC0603F0000TS: 电阻类型:厚膜电阻;阻值:0Ω;精度:±1%;功率:100mW;工作电压:75V;; LCSC Part Name: 0Ω ±1% 100mW 厚膜电阻; Supplier Part: C2906974; Manufacturer: FOJAN(富捷); Supplier Footprint: 0603; JLCPCB Part Class: Extended Part; Supplier: LCSC; Type: 厚膜电阻; Tolerance: ±1%; Power(Watts): 100mW; Voltage-Supply(Max): 75V; Operating Temperature: -55℃~+155℃
U20 = ASRPRO
U21 U22 = ZX-MX1.25-2PZZ: 插针结构:1x2P;间距:1.25mm;安装方式:直插;参考系列:PicoBlade(MX 1.25);总PIN数:2P;排数:1;每排PIN数:2;行距:-;额定电流:1A;触头材质:黄铜;触头镀层:锡;工作温度:-25℃~+85℃;; LCSC Part Name: 1x2P 间距:1.25mm 直插 系列:PicoBlade(MX 1.25); Supplier Part: C7430458; Manufacturer: Megastar(兆星); Supplier Footprint: 插件,P=1.25mm; JLCPCB Part Class: Extended Part; Datasheet: https://item.szlcsc.com/datasheet/ZX-MX1.25-2PZZ/8430327.html; Supplier: LCSC; Pins Structure: 1x2P; Pitch: 1.25mm; Mounting Type: 直插; Reference Series: PicoBlade(MX 1.25); Number of Pins: 2P; Number of Rows: 1; Number of PINs Per Row: 2; Current Rating: 1A; Contact Material: 黄铜; Contact Plating: 锡; Operating Temperature: -25℃~+85℃; Voltage Rating: 125V; Plastic Material: LCP; Flame Retardant Rating: UL94V-0; Color: 米色; Z-Height of the Board: 4.6mm; X-Length of Bottom Edge on Board (Spacing Line): 4.4mm; Y-Width of Bottom Edge on Board: 3.3mm
C5 C6 C19-C26 C36 = CC0603KRX7R9BB104: 容值:100nF;精度:±10%;额定电压:50V;材质(温度系数):X7R;; LCSC Part Name: 100nF ±10% 50V; Supplier Part: C14663; Manufacturer: YAGEO(国巨); Supplier Footprint: 0603; JLCPCB Part Class: Basic Part; Datasheet: https://atta.szlcsc.com/upload/public/pdf/source/20180910/C282072_33301C7F631E79921B82A8DAC6BCC5B3.pdf; Supplier: LCSC; Tolerance: ±10%; Voltage Rated: 50V; Temperature Coefficient: X7R; Check: true
C11-C15 = MA35V100M6X8: 容值:100uF;精度:±20%;额定电压:35V;纹波电流:2.9A@100kHz;等效串联电阻(ESR):30mΩ@100kHz;类型:聚合物;; LCSC Part Name: 100uF ±20% 35V; Supplier Part: C46550467; Manufacturer: JIERR(捷而瑞); Supplier Footprint: SMD,D6.3xL7.7mm; JLCPCB Part Class: Extended Part; Datasheet: https://item.szlcsc.com/datasheet/MA35V100M6X8/48680161.html; Supplier: LCSC; Tolerance: ±20%; Voltage Rating: 35V; Ripple Current: 2.9A@100kHz; Equivalent Series Resistance(ESR): 30mΩ@100kHz; Type: 聚合物; Diameter: 6.3mm; Height - Seated (Max): 7mm; Lifetime: 2000hrs@105℃; Operating Temperature: -55℃~+105℃
C37-C42 = CC0603JRNPO9BN330: 容值:33pF;精度:±5%;额定电压:50V;温度系数:NP0;; LCSC Part Name: 33pF ±5% 50V; Supplier Part: C107047; Manufacturer: YAGEO(国巨); Supplier Footprint: 0603; JLCPCB Part Class: Extended Part; Datasheet: https://item.szlcsc.com/datasheet/CC0603JRNPO9BN330/108263.html; Supplier: LCSC; Tolerance: ±5%; Voltage Rating: 50V; Temperature Coefficient: NP0; Voltage Rated: 50V; Check: true
CN1 CN3-CN5 CN11 = HCZZ0383-2: 插针结构:1x2P;间距:2mm;安装方式:卧贴;参考系列:HY;总PIN数:2P;排数:1;每排PIN数:2;行距:-;额定电流:2A;触头材质:铜;触头镀层:锡;工作温度:-40℃~+85℃;; LCSC Part Name: 米色 1x2P 间距:2mm 卧贴 系列:HY; Supplier Part: C7433618; Manufacturer: HC(虹成电子); Supplier Footprint: SMD,P=2mm,卧贴; JLCPCB Part Class: Extended Part; Datasheet: https://item.szlcsc.com/datasheet/HCZZ0383-2/8442643.html; Supplier: LCSC; Pins Structure: 1x2P; Pitch: 2mm; Mounting Type: 卧贴; Reference Series: HY; Number of Pins: 2P; Number of Rows: 1; Number of PINs Per Row: 2; Current Rating: 2A; Contact Material: 铜; Contact Plating: 锡; Operating Temperature: -40℃~+85℃; Voltage Rating: 200V; Plastic Material: LCP; Flame Retardant Rating: UL94V-0; Color: 米色; Z-Height of the Board: 5.2mm; X-Length of Bottom Edge on Board (Spacing Line): 8mm
H4-H8 H10 = PZ254R-11-03P: 插针结构:1x3P;间距:2.54mm;行距:-;圆针/方针:方针;安装方式:弯插;排数:单排;总PIN位数:3P;额定电流:3A;额定电压:250V;配合针长度:6mm;塑高:2.5mm;端接针长度:-;触头材质:黄铜;触头镀层:-;工作温度:-40℃~+105℃;颜色:黑色;; LCSC Part Name: 1x3P 间距:2.54mm 方针 弯插; Supplier Part: C492411; Manufacturer: XFCN(兴飞); Supplier Footprint: 弯插,P=2.54mm; JLCPCB Part Class: Extended Part; Datasheet: https://item.szlcsc.com/datasheet/PZ254R-11-03P/502967.html; Supplier: LCSC; Pin Structure: 1x3P; Pitch: 2.54mm; Circluar Pins/Square Pins: 方针; Mounting Type: 弯插; Number of Rows: 单排; Number of Pins: 3P; Current Rating: 3A; Voltage Rating (Max): 250V; Length of Mating Pin: 6mm; Insulation Height: 2.5mm; Contact Material: 黄铜; Operating Temperature: -40℃~+105℃; Color: 黑色
Q1-Q6 = MMBT3904_C7420353: 晶体管类型:NPN;集电极电流(Ic):200mA;集射极击穿电压(Vceo):40V;耗散功率(Pd):200mW;直流电流增益(hFE):100@10mA,1.0V;; LCSC Part Name: hFE:100-300，丝印:1AM NPN 电流:200mA 电压:40V; Supplier Part: C7420353; Manufacturer: R+O(宏嘉诚); Supplier Footprint: SOT-23; JLCPCB Part Class: Extended Part; Datasheet: https://item.szlcsc.com/datasheet/MMBT3904/8397175.html; Supplier: LCSC; type: NPN; Current - Collector(Ic): 200mA; Collector - Emitter Voltage VCEO: 40V; Pd - Power Dissipation: 200mW; DC Current Gain: 100@10mA,1.0V; Transition frequency(fT): 300MHz; Current - Collector Cutoff: 100nA; Vce Saturation(VCE(sat)): 300mV; Operating Temperature: -55℃~+150℃; Emitter-Base Voltage(Vebo): 6V
R11-R15 R17 R19 R21 R23 R25 = 0603WAF2101T5E: 电阻类型:厚膜电阻;阻值:2.1kΩ;精度:±1%;功率:100mW;工作电压:75V;温度系数:±100ppm/℃;; LCSC Part Name: 2.1kΩ ±1% 100mW 厚膜电阻; Supplier Part: C22902; Manufacturer: UNI-ROYAL(厚声); Supplier Footprint: 0603; JLCPCB Part Class: Extended Part; Datasheet: https://item.szlcsc.com/datasheet/0603WAF2101T5E/23629.html; Supplier: LCSC; Type: 厚膜电阻; Tolerance: ±1%; Power(Watts): 100mW; Voltage-Supply(Max): 75V; Temperature Coefficient: ±100ppm/℃; Operating Temperature: -55℃~+155℃
R16 R18 R20 R22 R24 R52 = 0603WAF0000T5E: 电阻类型:厚膜电阻;阻值:0Ω;精度:±1%;功率:100mW;工作电压:75V;温度系数:-;; LCSC Part Name: 0Ω ±1% 100mW 厚膜电阻; Supplier Part: C21189; Manufacturer: UNI-ROYAL(厚声); Supplier Footprint: 0603; JLCPCB Part Class: Basic Part; Datasheet: https://item.szlcsc.com/datasheet/0603WAF0000T5E/21903.html; Supplier: LCSC; Type: 厚膜电阻; Tolerance: ±1%; Power(Watts): 100mW; Voltage-Supply(Max): 75V; Operating Temperature: -55℃~+155℃
R29 R30 R33 R34 R36 R37 R39 R40 R42 R43 R45 R46 R48 R49 R58 R59 = 0603WAF4701T5E: 电阻类型:厚膜电阻;阻值:4.7kΩ;精度:±1%;功率:100mW;工作电压:75V;温度系数:±100ppm/℃;; LCSC Part Name: 4.7kΩ ±1% 100mW 厚膜电阻; Supplier Part: C23162; Manufacturer: UNI-ROYAL(厚声); Supplier Footprint: 0603; JLCPCB Part Class: Basic Part; Datasheet: https://item.szlcsc.com/datasheet/0603WAF4701T5E/23889.html; Supplier: LCSC; Type: 厚膜电阻; Tolerance: ±1%; Power(Watts): 100mW; Voltage-Supply(Max): 75V; Temperature Coefficient: ±100ppm/℃; Operating Temperature: -55℃~+155℃
R31 = 0603WAF1002T5E: 电阻类型:厚膜电阻;阻值:10kΩ;精度:±1%;功率:100mW;工作电压:75V;温度系数:±100ppm/℃;; LCSC Part Name: 厚膜电阻 10kΩ ±1% 100mW; Supplier Part: C25804; Manufacturer: UNI-ROYAL(厚声); Supplier Footprint: 0603; JLCPCB Part Class: Basic Part; Datasheet: https://item.szlcsc.com/datasheet/0603WAF1002T5E/26547.html; Supplier: LCSC; Type: 厚膜电阻; Tolerance: ±1%; Power(Watts): 100mW; Overload Voltage (Max): 75V; Temperature Coefficient: ±100ppm/℃; Operating Temperature Range: -55℃~+155℃; Voltage-Supply(Max): 75V; Operating Temperature: -55℃~+155℃
R32 R35 R38 R41 R44 R47 = 0603WAF1001T5E: 电阻类型:厚膜电阻;阻值:1kΩ;精度:±1%;功率:100mW;工作电压:75V;温度系数:±100ppm/℃;; LCSC Part Name: 1kΩ ±1% 100mW 厚膜电阻; Supplier Part: C21190; Manufacturer: UNI-ROYAL(厚声); Supplier Footprint: 0603; JLCPCB Part Class: Basic Part; Datasheet: https://item.szlcsc.com/datasheet/0603WAF1001T5E/21904.html; Supplier: LCSC; Type: 厚膜电阻; Tolerance: ±1%; Power(Watts): 100mW; Voltage-Supply(Max): 75V; Temperature Coefficient: ±100ppm/℃; Operating Temperature: -55℃~+155℃
R50 R54 R56 = 0603WAF0000T5E: 电阻类型:厚膜电阻;阻值:0Ω;精度:±1%;功率:100mW;工作电压:75V;温度系数:-;; LCSC Part Name: 0Ω ±1% 100mW 厚膜电阻; Supplier Part: C21189; Manufacturer: UNI-ROYAL(厚声); Supplier Footprint: 0603; JLCPCB Part Class: Basic Part; Datasheet: https://item.szlcsc.com/datasheet/0603WAF0000T5E/21903.html; Supplier: LCSC; Type: 厚膜电阻; Tolerance: ±1%; Power(Watts): 100mW; Voltage-Supply(Max): 75V; Operating Temperature: -55℃~+155℃; Overload Voltage (Max): 75V; Operating Temperature Range: -55℃~+155℃
R26 R27 R51 R55 R57 = 0603WAF1002T5E: 电阻类型:厚膜电阻;阻值:10kΩ;精度:±1%;功率:100mW;最大工作电压:75V;温度系数:±100ppm/℃;; LCSC Part Name: 厚膜电阻 10kΩ ±1% 100mW; Supplier Part: C25804; Manufacturer: UNI-ROYAL(厚声); Supplier Footprint: 0603; JLCPCB Part Class: 基础库; Datasheet: https://atta.szlcsc.com/upload/public/pdf/source/20200306/C422600_1E6D84923E4A46A82E41ADD87F860B5C.pdf; Supplier: LCSC; Type: 厚膜电阻; Tolerance: ±1%; Power(Watts): 100mW; Overload Voltage (Max): 75V; Temperature Coefficient: ±100ppm/℃; Operating Temperature Range: -55℃~+155℃
U1 U3-U6 = DRV8251ADDAR: DRV8251A 具有集成电流调节和电流检测反馈功能的 50V、4.1A H 桥电机驱动器; LCSC Part Name: 4.1A 具有集成电流调节和电流检测反馈功能的H 桥电机驱动器 50V; Supplier Part: C5218844; Manufacturer: TI(德州仪器); Supplier Footprint: SOPowerPAD-8; JLCPCB Part Class: Extended Part; Datasheet: https://www.ti.com/cn/lit/gpn/drv8251a; Supplier: LCSC
U8 = PCA9685PW/Q900,118: 类型:-;工作电压(DC):2.3V~5.5V;通道数:16;输出电压:5.5V;输出电流:25mA;调光:PWM;; Supplier Part: C92206; Manufacturer: NXP(恩智浦); Supplier Footprint: TSSOP-28; JLCPCB Part Class: Extended Part; Datasheet: https://www.nxp.com.cn/docs/en/data-sheet/PCA9685.pdf; Supplier: LCSC; Voltage - Input(DC): 2.3V~5.5V; Number of Channels: 16; Output Voltage: 5.5V; Output Current: 25mA; Dimming: PWM; Operating temperature: -40℃~+85℃
C3 C4 C27-C31 C82 C84 = CGA0603X7R104K500JT: 容值:100nF;精度:±10%;额定电压:50V;温度系数:X7R;; LCSC Part Name: 100nF ±10% 50V; Supplier Part: C6119867; Manufacturer: HRE(芯声); Supplier Footprint: 0603; JLCPCB Part Class: Extended Part; Datasheet: https://item.szlcsc.com/datasheet/CGA0603X7R104K500JT/7062573.html; Supplier: LCSC; Tolerance: ±10%; Voltage Rating: 50V; Temperature Coefficient: X7R
C32 = CC0603KRX7R9BB104: 容值:100nF;精度:±10%;额定电压:50V;材质(温度系数):X7R;; LCSC Part Name: 100nF ±10% 50V; Supplier Part: C14663; Manufacturer: YAGEO(国巨); Supplier Footprint: 0603; JLCPCB Part Class: Basic Part; Datasheet: https://atta.szlcsc.com/upload/public/pdf/source/20180910/C282072_33301C7F631E79921B82A8DAC6BCC5B3.pdf; Supplier: LCSC; Tolerance: ±10%; Voltage Rated: 50V; Temperature Coefficient: X7R
C33 C34 = CL10C220JB8NNNC: 容值:22pF;精度:±5%;额定电压:50V;温度系数:C0G;; LCSC Part Name: 22pF ±5% 50V; Supplier Part: C1653; Manufacturer: SAMSUNG(三星); Supplier Footprint: 0603; JLCPCB Part Class: Basic Part; Datasheet: https://item.szlcsc.com/datasheet/CL10C220JB8NNNC/2005.html; Supplier: LCSC; Tolerance: ±5%; Voltage Rating: 50V; Temperature Coefficient: C0G
D5 = NCD0805G1: 灯头类型:-;发光颜色:绿色;正向压降(Vf):2.5V~3.6V;功率:72mW;正向电流:20mA;波长:525nm~537.5nm;二极管配置:独立二极管;透镜颜色:-;色温:-;发光强度:400mcd;发光角度:130°;载带方式:-;工作温度:-30℃~+85℃;; LCSC Part Name: 片式发光二极管; Supplier Part: C84260; Manufacturer: 国星光电; Supplier Footprint: 0805; JLCPCB Part Class: Extended Part; Datasheet: https://item.szlcsc.com/datasheet/NCD0805G1/85429.html; Supplier: LCSC; Illumination Color: 绿色; Voltage - Forward(Vf): 2.5V~3.6V; Power(Watts): 72mW; Forward Current: 20mA; Wavelength - Dominant: 525nm~537.5nm; Peak Wavelength: 520nm; Diode Configuration: 独立二极管; Luminous Intensity: 400mcd; Viewing Angle: 130°; Operating Temperature: -30℃~+85℃
H9 = PZ254V-11-05P: 插针结构:1x5P;间距:2.54mm;行距:-;圆针/方针:方针;安装方式:直插;排数:单排;总PIN位数:5P;额定电流:3A;额定电压:250V;配合针长度:6mm;塑高:2.5mm;端接针长度:3mm;触头材质:黄铜;触头镀层:-;工作温度:-40℃~+105℃;颜色:黑色;; LCSC Part Name: 1x5P 间距:2.54mm 方针 直插; Supplier Part: C492404; Manufacturer: XFCN(兴飞); Supplier Footprint: 插件,P=2.54mm; JLCPCB Part Class: Extended Part; Datasheet: https://item.szlcsc.com/datasheet/PZ254V-11-05P/502960.html; Supplier: LCSC; Pin Structure: 1x5P; Pitch: 2.54mm; Circluar Pins/Square Pins: 方针; Mounting Type: 直插; Number of Rows: 单排; Number of Pins: 5P; Current Rating: 3A; Voltage Rating (Max): 250V; Length of Mating Pin: 6mm; Insulation Height: 2.5mm; Length of End Connection Pin: 3mm; Contact Material: 黄铜; Operating Temperature: -40℃~+105℃; Color: 黑色
R28 R53 = 0603WAF2000T5E: 电阻类型:厚膜电阻;阻值:200Ω;精度:±1%;功率:100mW;工作电压:75V;温度系数:±100ppm/℃;; LCSC Part Name: 200Ω ±1% 100mW 厚膜电阻; Supplier Part: C8218; Manufacturer: UNI-ROYAL(厚声); Supplier Footprint: 0603; JLCPCB Part Class: Basic Part; Datasheet: https://item.szlcsc.com/datasheet/0603WAF2000T5E/8708.html; Supplier: LCSC; Type: 厚膜电阻; Tolerance: ±1%; Power(Watts): 100mW; Voltage-Supply(Max): 75V; Temperature Coefficient: ±100ppm/℃; Operating Temperature: -55℃~+155℃
SW1 SW2 = TS-1101-C-W: 电路结构:单刀单掷;按钮形状:矩形按钮;作用力:260gf;安装方式:立贴;开关长度:6mm;开关宽度:3.6mm;开关高度:2.5mm;带支架:不带;触点电流:50mA;额定电压(AC):-;额定电压(DC):12V;额定功率:-;绝缘电阻:-;带灯:无;机械寿命:5万次;; LCSC Part Name: 6*3.6*2.5mm 立贴 轻触开关; Supplier Part: C318938; Manufacturer: XKB Connectivity(中国星坤); Supplier Footprint: SMD; JLCPCB Part Class: Extended Part; Datasheet: https://atta.szlcsc.com/upload/public/pdf/source/20200227/C318938_C2E53B1EEDE37D980A33616AC086DE53.pdf; Supplier: LCSC; Circuit: 单刀单掷; Actuator Style: 矩形按钮; Operating Force: 260gf; Mounting Style: 立贴; Switch Length: 6mm; Switch Width: 3.6mm; Switch Height: 2.5mm; Strike Gundam: 不带; Contact Current: 50mA; Voltage Rating (DC): 12V; Actuator/Cap Color: 白色带淡绿; With Lamp: 无; Mechanical Life: 5万次; Operating Temperature: -30℃~+85℃
SW3 = 2.54-4P TPGT: 类型:平拨,凸起式;电路结构:单刀单掷;开关位数:4位;额定电流:25mA;额定电压:24V;工作寿命:2千次;颜色:黑色;; LCSC Part Name: 2.54-4P贴片高推有LOGO编带; Supplier Part: C6331176; Manufacturer: SHOU HAN(首韩); Supplier Footprint: SMD,P=2.54mm; JLCPCB Part Class: Extended Part; Datasheet: https://item.szlcsc.com/datasheet/2.54-4P%2520TPGT/7279369.html; Supplier: LCSC; Type: 平拨,凸起式; Circuit: 单刀单掷; Number of Positions: 4位; Termination Style: 鸥翼型; Lead Pitch: 2.54mm; Current Rating: 25mA; Voltage Rating: 24V; Operating Temperature: -30℃~+85℃; Operating Life: 2千次; Color: 黑色
TP1 TP2 TP4 TP7 TP9 TP10 = Test-Point: Test Point 测试点; Check: false
U7 = GD32F103C8T6: CPU内核:ARM Cortex-M3;CPU最大主频:108MHz;; LCSC Part Name: Arm- Cortex--M3 32-bit MCU; Supplier Part: C77994; Manufacturer: GigaDevice(兆易创新); Supplier Footprint: LQFP-48(7x7); JLCPCB Part Class: Extended Part; Datasheet: https://item.szlcsc.com/datasheet/GD32F103C8T6/79128.html; Supplier: LCSC; CPU Core: ARM Cortex-M3; CPU Maximum Speed: 108MHz; Program Storage Size: 64KB; Program Memory Type: FLASH; Number of I/O: 37; ADC (Bit): 12bit; Voltage - Supply: 2.6V~3.6V
U11 = WAFER-PH2.0-6PZZ: 插针结构:1x6P;间距:2mm;安装方式:直插;参考系列:PH;总PIN数:6P;排数:1;每排PIN数:6;行距:-;额定电流:2A;触头材质:黄铜;触头镀层:锡;工作温度:-25℃~+85℃;; LCSC Part Name: 1x6P 间距:2mm 直插 系列:PH; Supplier Part: C5359603; Manufacturer: XUNPU(讯普); Supplier Footprint: 插件,P=2mm; JLCPCB Part Class: Extended Part; Datasheet: https://atta.szlcsc.com/upload/public/pdf/source/20241108/09B74E94153224768C62B7F095CB8C18.pdf; Supplier: LCSC; Pins Structure: 1x6P; Pitch: 2mm; Mounting Type: 直插; Reference Series: PH; Number of Pins: 6P; Number of Rows: 1; Number of PINs Per Row: 6; Current Rating: 2A; Contact Material: 黄铜; Contact Plating: 锡; Operating Temperature: -25℃~+85℃; Voltage Rating: 250V; Plastic Material: PA66; Flame Retardant Rating: UL94V-0; Color: 白色; Z-Height of the Board: 6.05mm; X-Length of Bottom Edge on Board (Spacing Line): 14mm; Y-Width of Bottom Edge on Board: 4.7mm
X1 = X32258MSB4SI: 晶振类型:贴片晶振;频率:8MHz;常温频差:±10ppm;负载电容:20pF;频率稳定度:±20ppm;; LCSC Part Name: YSX321SL 8MHZ 4P 3225 20PF ±10PPM -40~85℃ (±20PPM); Supplier Part: C2682774; Manufacturer: YXC(扬兴晶振); Supplier Footprint: SMD3225-4P; JLCPCB Part Class: Extended Part; Datasheet: https://item.szlcsc.com/datasheet/X32258MSB4SI/2777871.html; Supplier: LCSC; Type: 贴片晶振; Normal temperature Frequency Tolerance: ±10ppm; Load Capacitance: 20pF; Frequency Stability: ±20ppm; Equivalent Series Resistance(ESR): 120Ω; Operating Temperature: -40℃~+85℃
C1 C2 = CGA0603X5R106K100JT: 容值:10uF;精度:±10%;额定电压:10V;温度系数:X5R;; LCSC Part Name: 10uF ±10% 10V; Supplier Part: C6119842; Manufacturer: HRE(芯声); Supplier Footprint: 0603; JLCPCB Part Class: Extended Part; Datasheet: https://item.szlcsc.com/datasheet/CGA0603X5R106K100JT/7062548.html; Supplier: LCSC; Tolerance: ±10%; Voltage Rating: 10V; Temperature Coefficient: X5R; Check: false
C7 C114 = CC0603JRNPO9BN750: 容值:75pF;精度:±5%;额定电压:50V;材质(温度系数):NP0;; LCSC Part Name: 75pF ±5% 50V; Supplier Part: C282074; Manufacturer: YAGEO(国巨); Supplier Footprint: 0603; JLCPCB Part Class: 扩展库; Datasheet: https://atta.szlcsc.com/upload/public/pdf/source/20181008/C309499_21CC21451B82C39E3D92150FD6B30293.pdf; Supplier: LCSC; Tolerance: ±5%; Voltage Rated: 50V; Temperature Coefficient: NP0; Voltage Rating: 50V
C8-C10 C83 C87 C113 = CGA0805X5R226M350MT: 容值:22uF;精度:±20%;额定电压:35V;材质(温度系数):X5R;; LCSC Part Name: 22uF ±20% 35V; Supplier Part: C6119901; Manufacturer: HRE(芯声); Supplier Footprint: 0805; JLCPCB Part Class: 扩展库; Datasheet: https://atta.szlcsc.com/upload/public/pdf/source/20231129/D589D0CC4D260F7AC3A77E53B455CCB3.pdf; Supplier: LCSC; Tolerance: ±20%; Voltage Rated: 35V; Temperature Coefficient: X5R
C16 = JVJ35V470M10x10: 容值:470uF;精度:±20%;额定电压:35V;纹波电流:320mA@120Hz;; LCSC Part Name: 470uF ±20% 35V; Supplier Part: C46550413; Manufacturer: JIERR(捷而瑞); Supplier Footprint: SMD,D10xL10.5mm; JLCPCB Part Class: Extended Part; Datasheet: https://item.szlcsc.com/datasheet/JVJ35V470M10x10/48680107.html; Supplier: LCSC; Tolerance: ±20%; Voltage Rating: 35V; Ripple Current: 320mA@120Hz; Diameter: 10mm; Height - Seated (Max): 10.5mm; Lifetime: 2000hrs@105℃; Operating Temperature: -55℃~+105℃
D3 = SMBJ36A_C353364: 反向截止电压(Vrwm):36V;钳位电压:58.1V;峰值脉冲电流(Ipp):10.4A@10/1000us;峰值脉冲功率(Ppp):600W@10/1000us;击穿电压:44.2V;; LCSC Part Name: TVS 36V截止 峰值浪涌电流：10.4A@10/1000us; Supplier Part: C353364; Manufacturer: 晶导微电子; Supplier Footprint: SMB; JLCPCB Part Class: Extended Part; Datasheet: https://item.szlcsc.com/datasheet/SMBJ36A/329113.html; Supplier: LCSC; Reverse Stand-Off Voltage (Vrwm): 36V; Clamping Voltage: 58.1V; Peak Pulse Current (Ipp): 10.4A@10/1000us; Peak Pulse Power Dissipation (Ppp): 600W@10/1000us; Voltage - Breakdown: 44.2V; Reverse Leakage Current (Ir): 1uA; Type: TVS; Junction Capacitance: 390pF
D4 = B260A-13-F: 正向压降(Vf):700mV@2A;直流反向耐压(Vr):60V;整流电流:2A;; LCSC Part Name: 电压:60V 电流:2A; Supplier Part: C109094; Manufacturer: DIODES(美台); Supplier Footprint: SMA; JLCPCB Part Class: Extended Part; Datasheet: https://item.szlcsc.com/datasheet/B260A-13-F/110315.html; Supplier: LCSC; Voltage - Forward(Vf@If): 700mV@2A; Voltage - DC Reverse(Vr): 60V; Current - Rectified: 2A; Reverse Leakage Current (Ir): 500uA@60V; Operating Junction Temperature Range: -65℃~+150℃; Non-Repetitive Peak Forward Surge Current: 50A
D6 = SS34_C7420365: 二极管配置:独立式;正向压降(Vf):550mV@3A;直流反向耐压(Vr):40V;整流电流:3A;; LCSC Part Name: 电压:40V 电流:3A; Supplier Part: C7420365; Manufacturer: R+O(宏嘉诚); Supplier Footprint: SMA(DO-214AC); JLCPCB Part Class: Extended Part; Datasheet: https://item.szlcsc.com/datasheet/SS34/8397187.html; Supplier: LCSC; Diode Configuration: 独立式; Voltage - Forward(Vf@If): 550mV@3A; Voltage - DC Reverse(Vr): 40V; Current - Rectified: 3A; Reverse Leakage Current (Ir): 200uA@40V
DC1 = DC-005-A200: 连接器类型:DC电源插座;安装方式:弯插;触点内径:2mm;触点外径:6.4mm;额定电流:3A;额定电压:30V;工作温度:-20℃~+70℃;; LCSC Part Name: DC电源插座 内径:2mm 外径:6.4mm; Supplier Part: C720557; Manufacturer: XUNPU(讯普); Supplier Footprint: 插件; JLCPCB Part Class: Extended Part; Datasheet: https://item.szlcsc.com/datasheet/DC-005-A200/763564.html; Supplier: LCSC; Connector Type: DC电源插座; Mounting Style: 弯插; Inside Contact Diameter: 2mm; Outside Contact Diameter: 6.4mm; Current Rating (Max): 3A; Voltage Rating (Max): 30V; Operating Temperature Range: -20℃~+70℃; Mounting Type: 弯插; Current Rating: 3A; Operating Temperature: -20℃~+70℃; Check: true
L1 L9 = FXL0530-100-M: 电感值:10uH;精度:±20%;额定电流:3.2A;饱和电流(Isat):3.5A;类型:一体成型电感;; LCSC Part Name: 10uH ±20% 3.5A; Supplier Part: C177248; Manufacturer: cjiang(长江微电); Supplier Footprint: SMD,5.2x5.4mm; JLCPCB Part Class: 扩展库; Datasheet: https://atta.szlcsc.com/upload/public/pdf/source/20230516/4BF6F9C76E81720F52A39ED5FFFA18B4.pdf; Supplier: LCSC; Tolerance: ±20%; Rated Current: 3.2A; Saturation Current (Isat): 3.5A; DC Resistance (DCR): 125mΩ; Type: 一体成型电感
R1 R139 = 0603WAF1003T5E: 电阻类型:厚膜电阻;阻值:100kΩ;精度:±1%;功率:100mW;最大工作电压:75V;温度系数:±100ppm/℃;; LCSC Part Name: 100kΩ ±1% 100mW 厚膜电阻; Supplier Part: C25803; Manufacturer: UNI-ROYAL(厚声); Supplier Footprint: 0603; JLCPCB Part Class: 基础库; Datasheet: https://atta.szlcsc.com/upload/public/pdf/source/20200306/C422600_1E6D84923E4A46A82E41ADD87F860B5C.pdf; Supplier: LCSC; Type: 厚膜电阻; Tolerance: ±1%; Power(Watts): 100mW; Overload Voltage (Max): 75V; Temperature Coefficient: ±100ppm/℃; Operating Temperature Range: -55℃~+155℃; Voltage-Supply(Max): 75V; Operating Temperature: -55℃~+155℃
R2 R141 = HP03W5F500JT5E: 电阻类型:厚膜电阻;阻值:50Ω;精度:±1%;功率:200mW;最大工作电压:75V;温度系数:±100ppm/℃;; LCSC Part Name: 50Ω ±1% 200mW 厚膜电阻; Supplier Part: C2759402; Manufacturer: UNI-ROYAL(厚声); Supplier Footprint: 0603; JLCPCB Part Class: 扩展库; Datasheet: https://atta.szlcsc.com/upload/public/pdf/source/20210330/C2758946_2E791960B6217541E78FA2D6015E16C7.pdf; Supplier: LCSC; Type: 厚膜电阻; Tolerance: ±1%; Power(Watts): 200mW; Overload Voltage (Max): 75V; Temperature Coefficient: ±100ppm/℃; Operating Temperature Range: -55℃~+155℃
R3 R140 = 0603WAF1332T5E: 电阻类型:厚膜电阻;阻值:13.3kΩ;精度:±1%;功率:100mW;最大工作电压:75V;温度系数:±100ppm/℃;; LCSC Part Name: 13.3kΩ ±1% 100mW 厚膜电阻; Supplier Part: C25952; Manufacturer: UNI-ROYAL(厚声); Supplier Footprint: 0603; JLCPCB Part Class: 扩展库; Datasheet: https://atta.szlcsc.com/upload/public/pdf/source/20200306/C422600_1E6D84923E4A46A82E41ADD87F860B5C.pdf; Supplier: LCSC; Type: 厚膜电阻; Tolerance: ±1%; Power(Watts): 100mW; Overload Voltage (Max): 75V; Temperature Coefficient: ±100ppm/℃; Operating Temperature Range: -55℃~+155℃
R4 R137 = 0603WAF5113T5E: 电阻类型:厚膜电阻;阻值:511kΩ;精度:±1%;功率:100mW;最大工作电压:75V;温度系数:±100ppm/℃;; LCSC Part Name: 511kΩ ±1% 100mW 厚膜电阻; Supplier Part: C23194; Manufacturer: UNI-ROYAL(厚声); Supplier Footprint: 0603; JLCPCB Part Class: 扩展库; Datasheet: https://atta.szlcsc.com/upload/public/pdf/source/20200306/C422600_1E6D84923E4A46A82E41ADD87F860B5C.pdf; Supplier: LCSC; Type: 厚膜电阻; Tolerance: ±1%; Power(Watts): 100mW; Overload Voltage (Max): 75V; Temperature Coefficient: ±100ppm/℃; Operating Temperature Range: -55℃~+155℃
R5 R138 = FRC0603F1053TS: 电阻类型:厚膜电阻;阻值:105kΩ;精度:±1%;功率:100mW;最大工作电压:75V;温度系数:±100ppm/℃;; LCSC Part Name: 105kΩ ±1% 100mW 厚膜电阻; Supplier Part: C2933128; Manufacturer: FOJAN(富捷); Supplier Footprint: 0603; JLCPCB Part Class: 扩展库; Datasheet: https://atta.szlcsc.com/upload/public/pdf/source/20211221/925EC7D7225764EE0046F22065062C87.pdf; Supplier: LCSC; Type: 厚膜电阻; Tolerance: ±1%; Power(Watts): 100mW; Overload Voltage (Max): 75V; Temperature Coefficient: ±100ppm/℃; Operating Temperature Range: -55℃~+155℃
R60 R61 = 0603WAF5101T5E: 电阻类型:厚膜电阻;阻值:5.1kΩ;精度:±1%;功率:100mW;工作电压:75V;温度系数:±100ppm/℃;; LCSC Part Name: 5.1kΩ ±1% 100mW 厚膜电阻; Supplier Part: C23186; Manufacturer: UNI-ROYAL(厚声); Supplier Footprint: 0603; JLCPCB Part Class: Basic Part; Datasheet: https://item.szlcsc.com/datasheet/0603WAF5101T5E/23913.html; Supplier: LCSC; Type: 厚膜电阻; Tolerance: ±1%; Power(Watts): 100mW; Voltage-Supply(Max): 75V; Temperature Coefficient: ±100ppm/℃; Operating Temperature: -55℃~+155℃; Overload Voltage (Max): 75V; Operating Temperature Range: -55℃~+155℃; Check: false
U2 U28 = TPS54302DDCR: 功能类型:降压型;输出类型:可调;输入电压:4.5V~28V;输出电压:596mV~28V;输出电流(最大值):3A;; Supplier Part: C311983; Manufacturer: TI(德州仪器); Supplier Footprint: TSOT-23-6; JLCPCB Part Class: 扩展库; Datasheet: https://www.ti.com/cn/lit/gpn/tps54302; Supplier: LCSC; Function: 降压型; Output Type: 可调; Input Voltage: 4.5V~28V; Output Voltage: 596mV~28V; Output Current (Max): 3A; Switching Frequency: 400kHz; Operating Temperature: -40℃~+125℃@(TJ); Synchronous Rectification: 是; Number of Outputs: 1; Topology: 降压式; Switch tube (built-in/external): 内置
U9 U10 U12-U15 = M3*12+3: 铜柱M3*12+3; LCSC Part Name: 新宏辉达 单通头六角铜柱M3*12+3（不环保） PCBA主板隔离螺柱; Supplier Part: C110574; Manufacturer: XHHD(新宏辉达); JLCPCB Part Class: Extended Part; Supplier: LCSC; Check: false
U16 = CJT1117B-3.3: 输出类型:固定;最大输入电压:20V;输出电压:3.3V;最大输出电流:1A;电源纹波抑制比(PSRR):65dB;输出极性:正极;; LCSC Part Name: 输入15V 输出3.3V 1A; Supplier Part: C78777; Manufacturer: CJ(江苏长电/长晶); Supplier Footprint: SOT-223-4; JLCPCB Part Class: 扩展库; Datasheet: https://atta.szlcsc.com/upload/public/pdf/source/20210806/C78777_677BC401CF91CFF5173CBBB8BD41D802.pdf; Supplier: LCSC; Output Type: 固定; Maximum Input Voltage: 20V; Output Voltage: 3.3V; MAX Output Current: 1A; Power Supply Rejection Ratio (PSRR): 65dB; Dropout Voltage: 1.3V; standby current: 10mA; Output Polarity: 正极; Number of Outputs: 1; Check: true
U17 = WAFER-PH2.0-4PWZ: 插针结构:1x4P;间距:2mm;安装方式:弯插;参考系列:PH;总PIN数:4P;排数:1;每排PIN数:4;行距:-;额定电流:2A;触头材质:黄铜;触头镀层:锡;工作温度:-25℃~+85℃;; LCSC Part Name: 1x4P 间距:2mm 弯插 系列:PH; Supplier Part: C5359612; Manufacturer: XUNPU(讯普); Supplier Footprint: 弯插,P=2mm; JLCPCB Part Class: Extended Part; Datasheet: https://item.szlcsc.com/datasheet/WAFER-PH2.0-4PWZ/6173848.html; Supplier: LCSC; Pins Structure: 1x4P; Pitch: 2mm; Mounting Type: 弯插; Reference Series: PH; Number of Pins: 4P; Number of Rows: 1; Number of PINs Per Row: 4; Current Rating: 2A; Contact Material: 黄铜; Contact Plating: 锡; Operating Temperature: -25℃~+85℃; Voltage Rating: 250V; Plastic Material: PA66; Flame Retardant Rating: UL94V-0; Color: 白色; Z-Height of the Board: 4.7mm; X-Length of Bottom Edge on Board (Spacing Line): 10mm; Y-Width of Bottom Edge on Board: 6.05mm
USB1 = TYPE-C 16PIN 2MD(073): 连接器类型:Type-C;协议标准:-;公母:母;安装方式:卧贴;触点数量:16P;端口数量:1;额定电流 - 电源:3A;工作温度:-25℃~+85℃;; LCSC Part Name: Type-C 母 卧贴; Supplier Part: C2765186; Manufacturer: SHOU HAN(首韩); Supplier Footprint: SMD; JLCPCB Part Class: Extended Part; Datasheet: https://item.szlcsc.com/datasheet/TYPE-C%252016PIN%25202MD(073)/2901843.html; Supplier: LCSC; Connector Type: Type-C; Gender: 母; Mounting Type: 卧贴; Number of Contacts: 16P; Number of Ports: 1; Current Rating-Power: 3A; Voltage Rating: 5V; Connect-Disconnect Life: 1万次; Detection color: 黑色; Operating Temperature: -25℃~+85℃

## Nets
+5V: C1.2 C17.1 C87.2 C113.2 D6.1(A) H1.1 L9.1 R53.2 R141.2 U11.1 U16.3(Vin) U20.17(5V)
GND: C1.1 C2.1 C3.1 C5.1 C6.1 C8.1 C9.1 C10.1 C11.2 C12.2 C13.2 C14.2 C15.2 C16.2 C17.2 C19.1 C20.1 C21.1 C22.1 C23.1 C24.1 C25.1 C26.1 C27.1 C28.1 C29.1 C30.1 C31.1 C32.1 C33.2 C34.2 C36.2 C83.1 C84.1 C87.1 C113.1 CN1.3 CN1.4 CN3.3 CN3.4 CN4.3 CN4.4 CN5.3 CN5.4 CN11.3 CN11.4 CN14.1 D3.2(A) DC1.2 DC1.3 H1.4 H2.4 H3.4 H4.3 H5.3 H6.3 H7.3 H8.3 H9.5 H10.3 H11.4 Q1.2(E) Q2.2(E) Q3.2(E) Q4.2(E) Q5.2(E) Q6.2(E) R3.1 R5.1 R11.1 R12.1 R13.1 R14.1 R15.1 R26.1 R33.1 R36.1 R39.1 R42.1 R45.1 R48.1 R60.2 R61.2 R138.1 R140.1 SW2.2 TP2.1 U1.7(GND) U1.9(PAD) U2.1(GND) U3.7(GND) U3.9(PAD) U4.7(GND) U4.9(PAD) U5.7(GND) U5.9(PAD) U6.7(GND) U6.9(PAD) U7.8(VSSA) U7.23(VSS_1) U7.35(VSS_2) U7.47(VSS_3) U8.1(A0) U8.2(A1) U8.3(A2) U8.4(A3) U8.5(A4) U8.14(VSS) U8.24(A5) U8.25(EXTCLK) U11.6 U16.1(GND) U17.2 U20.18(GND) U28.1(GND) USB1.13(EH) USB1.14(EH) USB1.A1B12(GND) USB1.B1A12(GND) X1.2(GND) X1.4(GND)
V3.3: C2.2 C6.2 C20.2 C22.2 C24.2 C26.2 C27.2 C28.2 C29.2 C30.2 C31.2 C36.1 H2.1 H3.1 H11.1 R27.1 R28.2 R29.1 R30.1 R31.2 R52.2 SW1.1 U1.4(VREF) U3.4(VREF) U4.4(VREF) U5.4(VREF) U6.4(VREF) U7.1(VBAT) U7.9(VDDA) U7.24(VDD_1) U7.36(VDD_2) U7.48(VDD_3) U8.28(VDD) U16.2(Vout) U16.4(Vout) U17.1
VBUS: D6.2(K) USB1.A4B9(VBUS) USB1.B4A9(VBUS)
VIN: C3.2 C10.2 C16.1 C83.2 C84.2 D3.1(C) D4.1(K) R4.2 R17.1 R19.1 R21.1 R23.1 R25.1 R137.2 TP1.1 U2.3(VIN) U28.3(VIN)
ADC2: R9.1 SW3.2(A2) U7.17(PA7)
ADC3: R10.1 SW3.3(A3) U7.15(PA5)
ADC4: R62.1 SW3.4(A4) U7.14(PA4)
ASRPRO0_RX: H1.3 U20.15(GPIO_PB6)
ASRPRO0_TX: H1.2 U20.16(GPIO_PB5)
BOOT0: R26.2 SW1.2 TP7.1 U7.44(BOOT0)
FB1: C114.2 R139.1 R140.2 U28.4(FB)
FB2: C7.2 R1.1 R3.2 U2.4(FB)
INT: H9.4 U7.20(PB2)
M1_OUT1: CN11.1 U4.6(OUT1)
M1_OUT2: CN11.2 U4.8(OUT2)
M2_OUT1: CN4.1 U1.6(OUT1)
M2_OUT2: CN4.2 U1.8(OUT2)
M3_OUT1: CN1.1 U3.6(OUT1)
M3_OUT2: CN1.2 U3.8(OUT2)
M4_OUT1: CN5.1 U5.6(OUT1)
M4_OUT2: CN5.2 U5.8(OUT2)
M5_OUT1: CN3.1 U6.6(OUT1)
M5_OUT2: CN3.2 U6.8(OUT2)
MIC1+: CN14.4 U22.1
MIC1-: CN14.5 U22.2
MIC+: CN14.2 R6.2
MIC-: CN14.3 R7.2
MOTOR1_ADC: C5.2 R11.2 R62.2 SW3.5(B4) U4.1(IPROPI)
MOTOR2_ADC: C19.2 R10.2 R12.2 SW3.6(B3) U1.1(IPROPI)
MOTOR3_ADC: C21.2 R9.2 R13.2 SW3.7(B2) U3.1(IPROPI)
MOTOR4_ADC: C23.2 R8.2 R14.2 SW3.8(B1) U5.1(IPROPI)
MOTOR5_ADC: C25.2 R15.2 U6.1(IPROPI)
MT1_IN1: U4.3(IN1) U8.6(LED0)
MT1_IN2: U4.2(IN2) U8.7(LED1)
MT2_IN1: U1.3(IN1) U8.8(LED2)
MT2_IN2: U1.2(IN2) U8.9(LED3)
MT3_IN1: U3.3(IN1) U8.10(LED4)
MT3_IN2: U3.2(IN2) U8.11(LED5)
MT4_IN1: U5.3(IN1) U8.12(LED6)
MT4_IN2: U5.2(IN2) U8.13(LED7)
MT5_IN1: U6.3(IN1) U8.16(LED9)
MT5_IN2: U6.2(IN2) U8.15(LED8)
NRST: C32.2 R27.2 SW2.1 U7.7(NRST)
PCA_OE: R31.1 U7.41(PB5) U8.23(OE#)
PCA_SCL: R30.2 U7.42(PB6) U8.26(SCL)
PCA_SDA: R29.2 U7.43(PB7) U8.27(SDA)
PWM1: H10.1 Q1.3(C) R34.1
PWM2: H4.1 Q2.3(C) R37.1
PWM3: H5.1 Q3.3(C) R40.1
PWM4: H6.1 Q4.3(C) R43.1
PWM5: H7.1 Q5.3(C) R46.1
PWM6: H8.1 Q6.3(C) R49.1
PWM_5V: C8.2 C9.2 H4.2 H5.2 H6.2 H7.2 H8.2 H10.2 L1.1 R2.2 R16.1 R18.1 R20.1 R22.1 R24.1 R34.2 R37.2 R40.2 R43.2 R46.2 R49.2
RK_RX1: U7.22(PB11) U17.4
RK_TX1: U7.21(PB10) U17.3
SCL: H9.2 R58.1 U7.18(PB0)
SDA: H9.3 R59.1 U7.19(PB1)
SIG_PWM1: C37.2 R32.1 U8.17(LED10)
SIG_PWM2: C38.2 R35.1 U8.18(LED11)
SIG_PWM3: C39.2 R38.1 U8.19(LED12)
SIG_PWM4: R56.2 U8.20(LED13)
SIG_PWM5: R54.2 U8.21(LED14)
SIG_PWM6: R50.2 U8.22(LED15)
SPI1_CS: U7.25(PB12) U11.5
SPI1_MISO: U7.27(PB14) U11.3
SPI1_MOSI: U7.28(PB15) U11.2
SPI1_SCK: U7.26(PB13) U11.4
SPK+: CN15.2 CN16.1 U20.9(SPK+) U21.2
SPK-: CN15.1 CN16.2 U20.8(SPK-) U21.1
SWCLK: H3.2 U7.37(PA14)
SWDIO: H3.3 U7.34(PA13)
TIMER0_CH0: R57.2 U7.29(PA8)
TIMER1_CH1/ADC1: R8.1 R55.2 SW3.1(A1) U7.11(PA1)
TIMER2_CH0/ADC5: R51.2 U7.16(PA6)
USART0_RX: H2.3 U7.31(PA10)
USART0_TX: H2.2 U7.30(PA9)
USART1_RX: H11.3 U7.12(PA2) U20.4(GPIO_PA3)
USART1_TX: H11.2 U7.13(PA3) U20.5(GPIO_PA2)
WK_LED: D5.2(K) U7.10(PA0_WAKEUP)
$1N40: D4.2(A) DC1.1 TP4.1
$1N85: R60.1 USB1.A5(CC1)
$1N86: R61.1 USB1.B5(CC2)
$1N93: R137.1 R138.2 U28.5(EN)
$1N94: C114.1 R139.2 R141.1
$1N99: C82.2 U28.6(BOOT)
$1N101: C82.1 L9.2 U28.2(SW)
$1N106: R4.1 R5.2 U2.5(EN)
$1N107: C7.1 R1.2 R2.1
$1N112: C4.2 U2.6(BOOT)
$1N114: C4.1 L1.2 U2.2(SW)
$2N9: C11.1 R16.2 R17.2 U4.5(VM)
$2N20: C14.1 R18.2 R19.2 U1.5(VM)
$2N64: C12.1 R20.2 R21.2 U3.5(VM)
$2N67: C15.1 R22.2 R23.2 U5.5(VM)
$2N70: C13.1 R24.2 R25.2 U6.5(VM)
$2N99: C37.1 Q1.1(B) R32.2 R33.2
$2N108: C38.1 Q2.1(B) R35.2 R36.2
$2N113: C39.1 Q3.1(B) R38.2 R39.2
$2N117: C40.2 R41.1 R56.1 R57.1
$2N118: C40.1 Q4.1(B) R41.2 R42.2
$2N122: C41.2 R44.1 R54.1 R55.1
$2N123: C41.1 Q5.1(B) R44.2 R45.2
$2N127: C42.2 R47.1 R50.1 R51.1
$2N128: C42.1 Q6.1(B) R47.2 R48.2
$3N48: C34.1 TP10.1 U7.6(PD1_OSC_OUT) X1.3
$3N49: C33.1 TP9.1 U7.5(PD0_OSC_IN) X1.1
$3N63: D5.1(A) R28.1
$3N129: H9.1 R52.1 R53.1 R58.2 R59.2
$5N30: R6.1 U20.11(MIC+)
$5N32: R7.1 U20.10(MIC-)

Not connected (* = marked no-connect by the designer): U7 2(PC13_TAMPER_RTC)* 3(PC14_OSC32_IN)* 4(PC15_OSC32_OUT)* 32(PA11)* 33(PA12)* 38(PA15)* 39(PB3)* 40(PB4)* 45(PB8)* 46(PB9)*; U9 1*; U10 1*; U12 1*; U13 1*; U14 1*; U15 1*; U20 1(3V3)* 2(GPIO_PA6)* 3(GPIO_PA5)* 6(GPIO_PA1)* 7(GPIO_PA0)* 12(MUTE)* 13(GPIO_PA4)* 14(GPIO_PC4)*; USB1 A6(Dp1)* A7(Dn1)* A8(SBU1)* B6(Dp2)* B7(Dn2)* B8(SBU2)*

## Notes on the sheets
sheet 1
- LDO-5V转3.3V电路
- 直流DC口
- 芯片和K230供电
- CtoC线供电
- 5路PWM供电
- TTL与RK通讯
sheet 2
- 5路电机驱动+6路单PWM输出
  频率都必须一样，仅占空比不一样
- 需要不同频率的可以把SIG4-6的0Ω替换
sheet 3
- 电机控制与过流检测
- 主控部分
- TIMER3_CH3
- TIMER3_CH2
- TIMER3_CH1
- TIMER3_CH0
- TIMER2_CH1
- TIMER2_CH0
- 关键复位状态：
  PA13 (JTMS /SWDIO):输入上拉
  PA14(JTCK/SWCLK):输入下拉
  PA15(JTDI):输入上拉
  PB4(NJTRST):输入上拉
  PB3(JTDO):输入浮空
- 预留外置通讯串口/
  给ASRPRO使用
- PH 2.0
- debug
- 预留SPI接口
- 手势识别
- WS2812灯带
- 电机是否要开启堵转检测
- MSH口
- green
- 软件自定义LED
sheet 4
- 外置CH340下载口
- 麦克风
- 麦克风
- 喇叭
sheet 5
- ASRPRO和GD32的串口TX-TX,RX-RX修改为交叉
- 修改了微雪的通信接口统一用2.0端子
